# EasyEDA Pro project BMS-Mainboard.epro, board PCB1
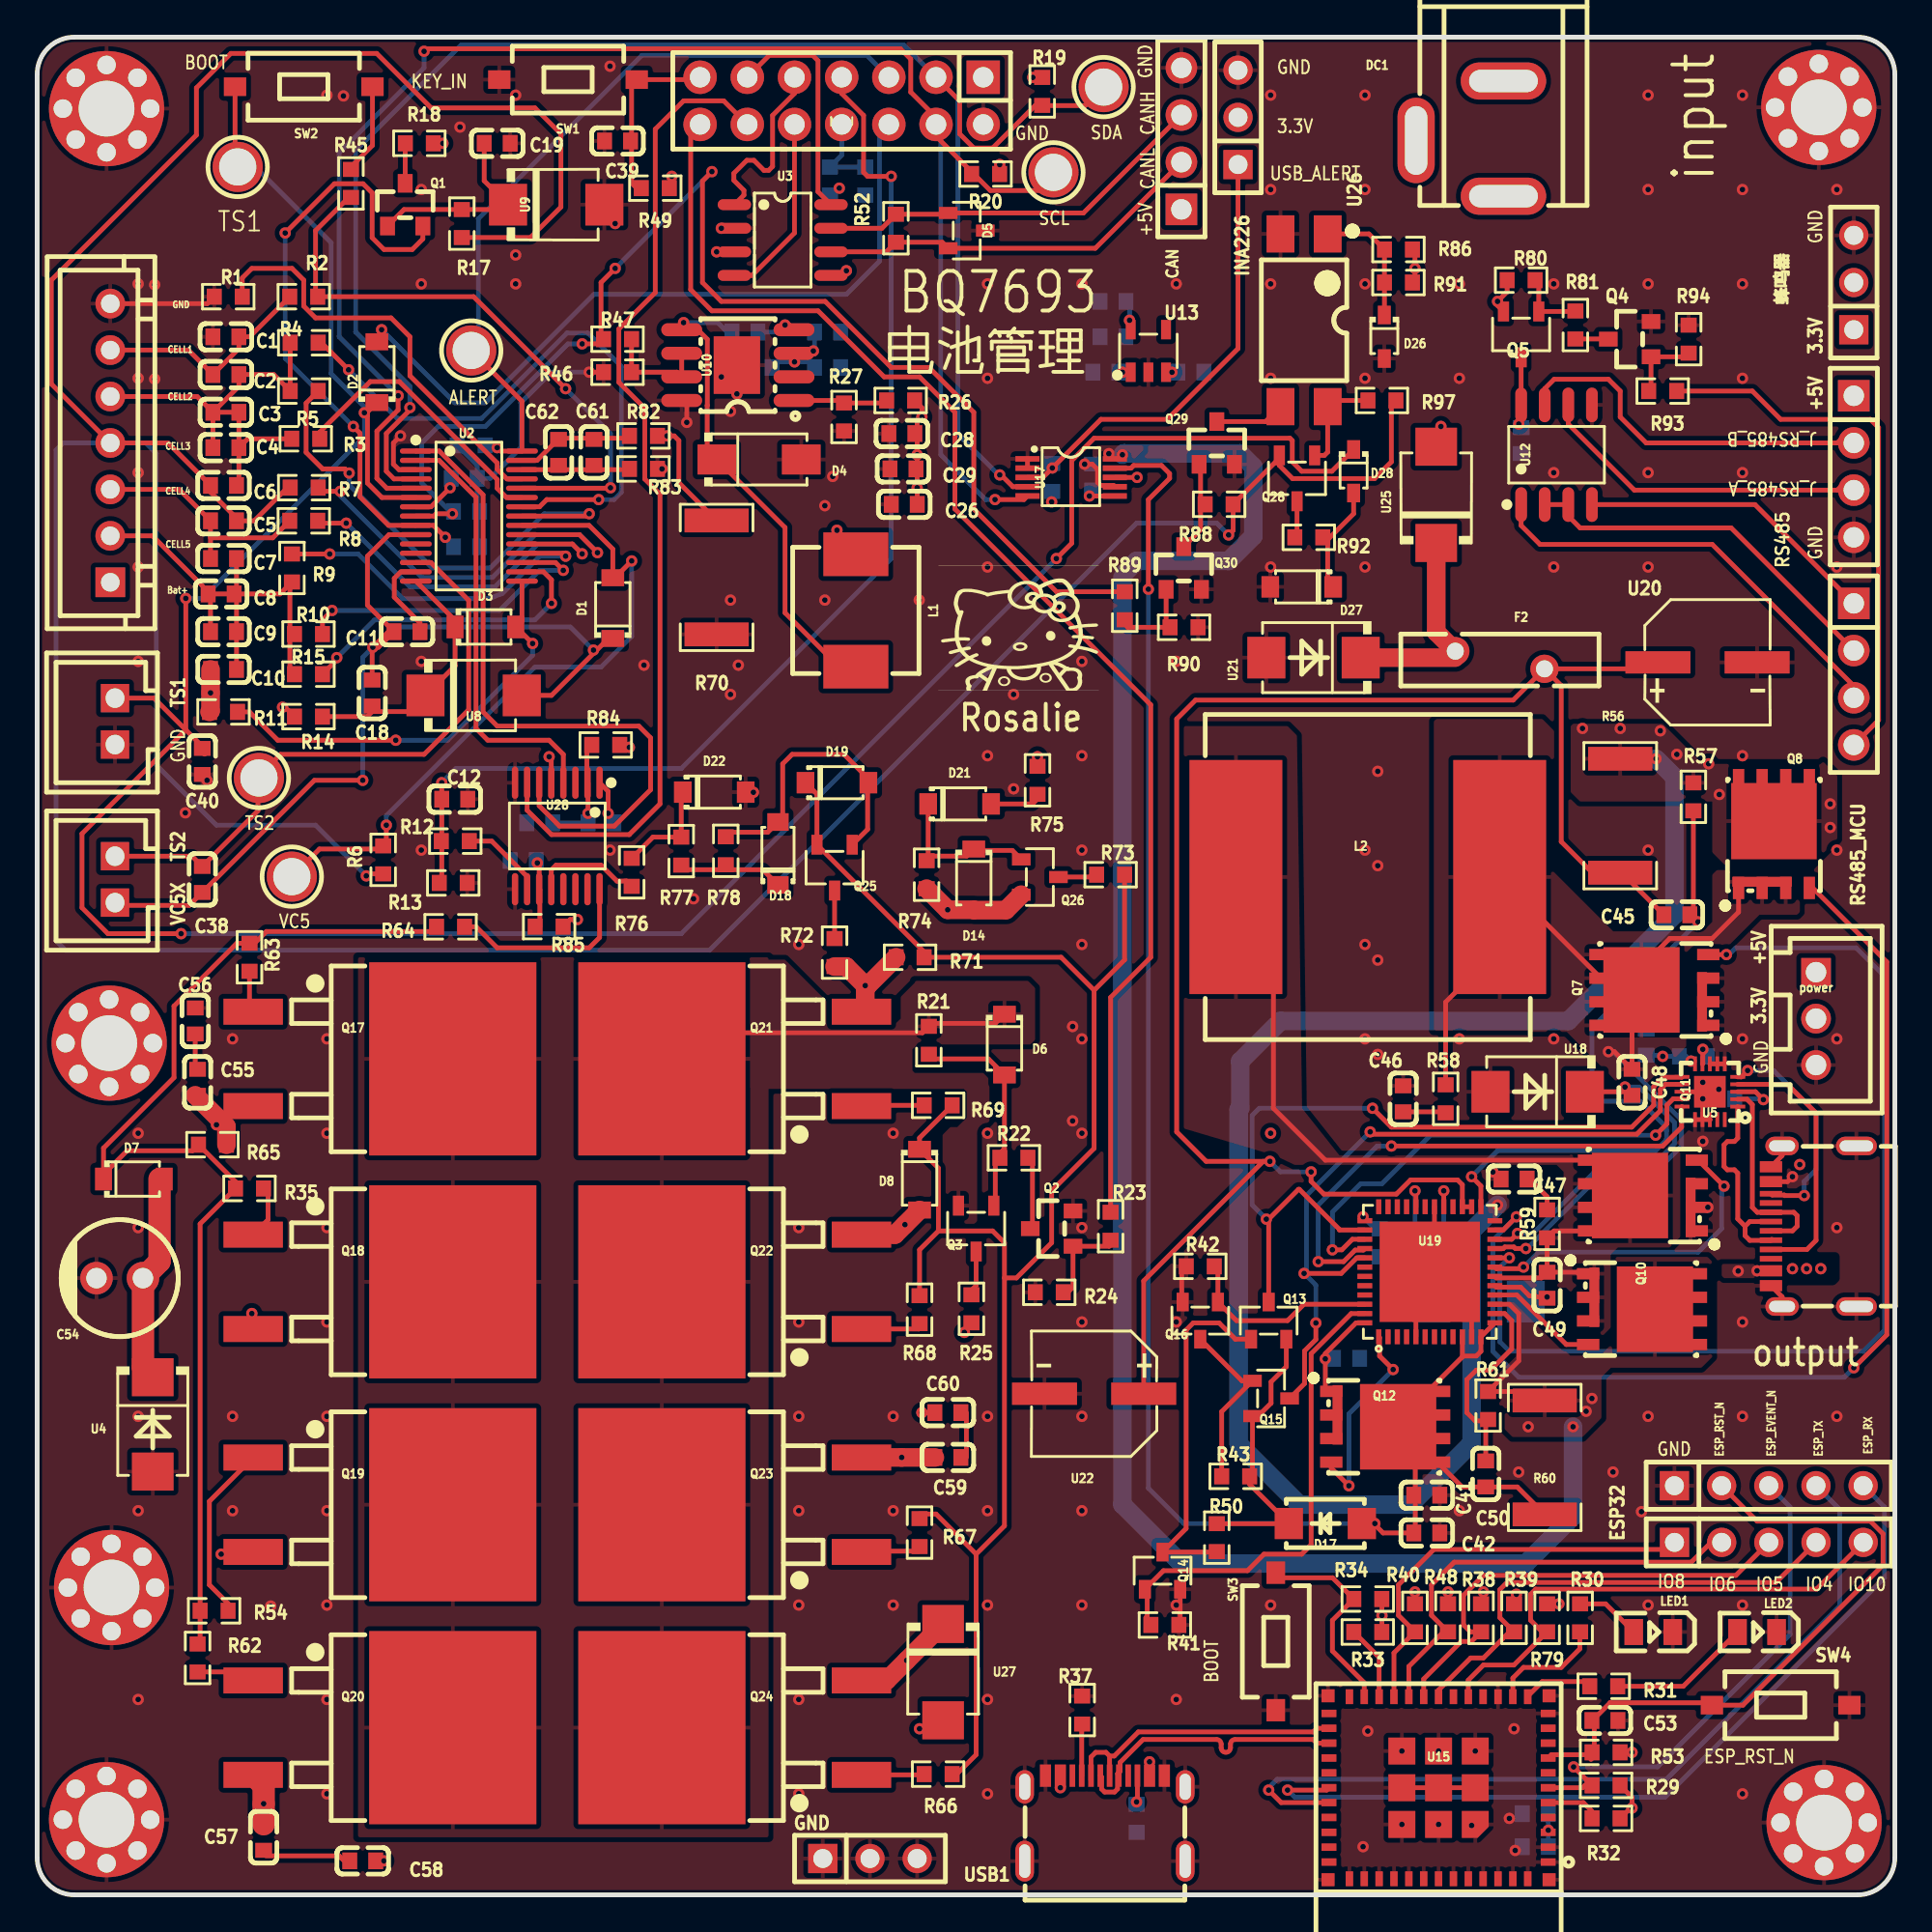
[diagram p7: board, top side]
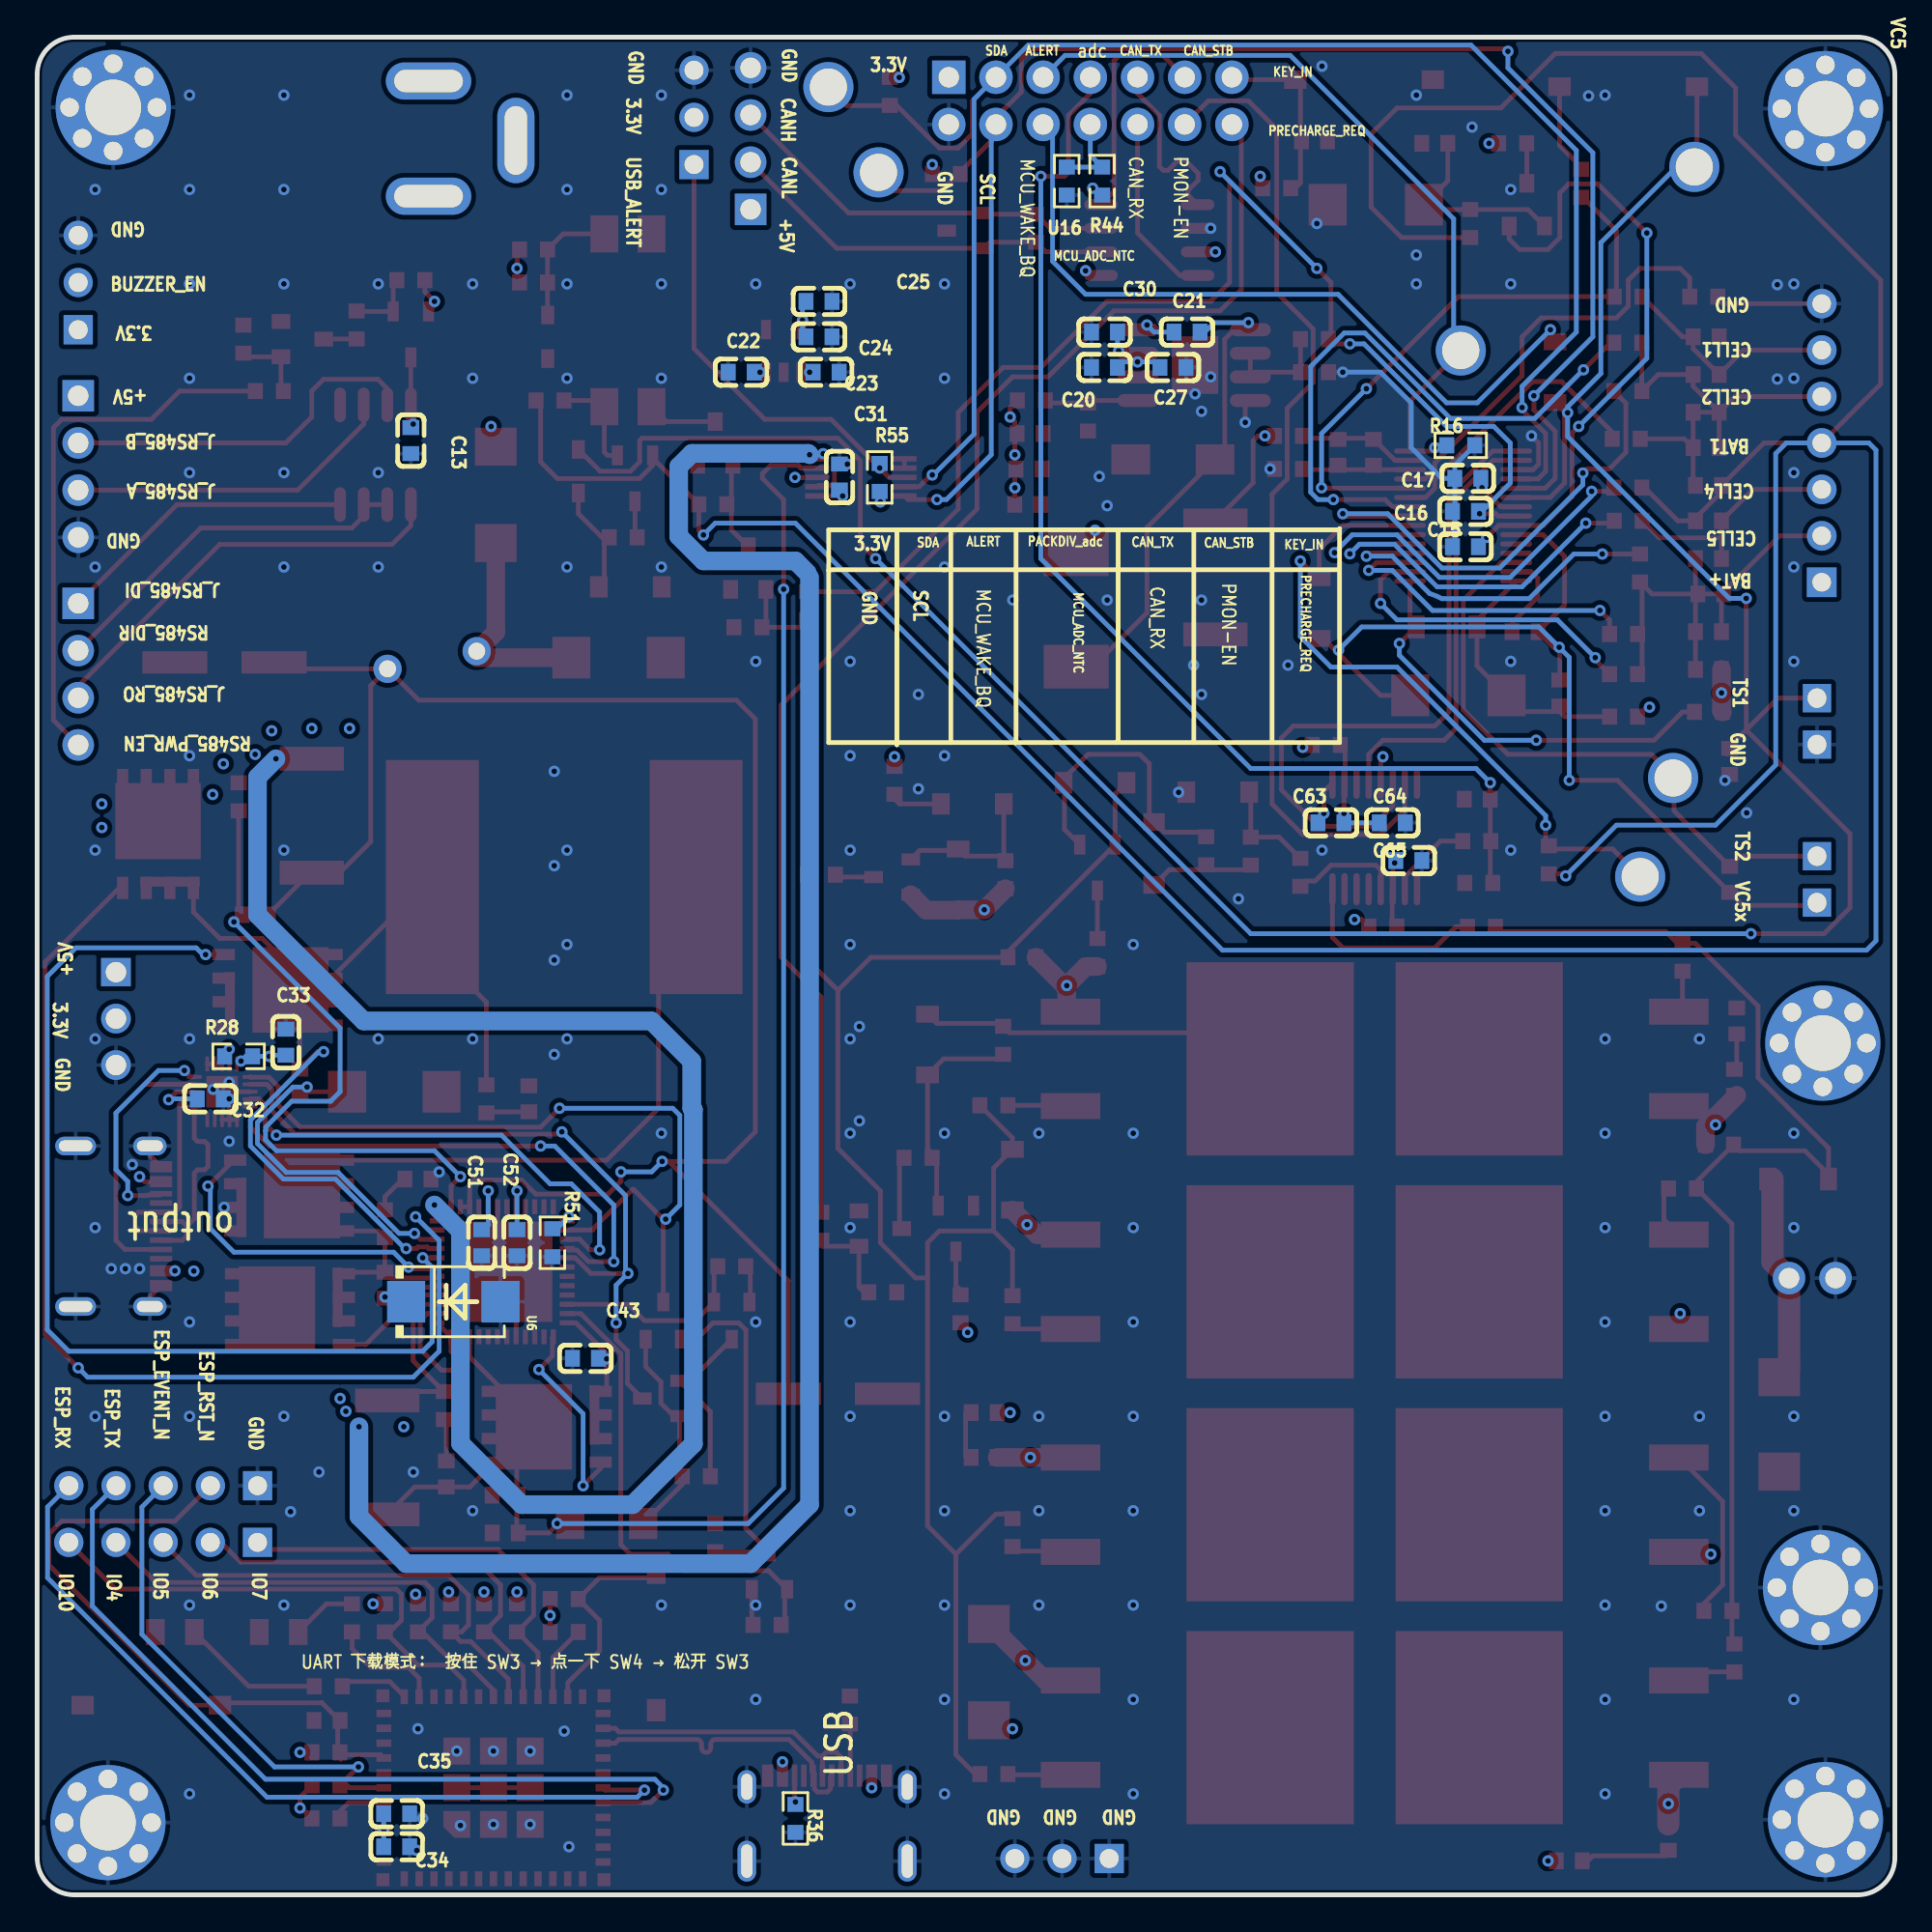
[diagram p8: board, bottom side, seen from below]

Outline 100 x 100 mm; copper layers: Top Layer, Inner1, Inner2, Bottom Layer. Coordinates in mm from the lower left corner of the outline.
Outline path: 0,98 0,2 arc(0.59,0.59) 2,0 98,0 arc(99.41,0.59) 100,2 100,98 arc(99.41,99.41) 98,100 2,100 arc(0.59,99.41) 0,98
Stack: Top Layer 0.035mm Outer layer thickness 1oz / Dielectric1 0.2104mm 7628 RC49% 8.6mil / Inner1 0.0152mm Inner layer thickness / Dielectric2 1.065mm 1.1mm H/HOZ Copper / Inner2 0.0152mm Inner layer thickness / Dielectric3 0.2104mm 7628 RC49% 8.6mil / Bottom Layer 0.035mm Outer layer thickness 1oz

## Design rules (mm)
net USB_D+: ESP_USB
net USB_D-: ESP_USB
spacing copperThickness1oz (default): track to track 0.102, other pairs 0.152 to 0.3
spacing copperThickness2oz: track to track 0.203, other pairs 0.152 to 0.3
track width copperThickness1oz (default): min 0.127, default 0.254, max 2.54
track width copperThickness2oz: min 0.203, default 0.254, max 2.54
differential pair differentialPair (default): width min 0.127, default 0.254, max 2.54; gap min 0.152, default 0.152
net GND uses copperRegion
net MID+ uses copperRegion
net LX1 uses copperRegion
net LX2 uses copperRegion
net PCON uses copperRegion
net PCIN uses copperRegion
net USB_VBUS uses copperRegion

## Placement (name value [footprint] x y rotation side)
C1  1uF  [C0603]  10.16 83.87 0 top
C2  1uF  [C0603]  10.16 81.84 0 top
C3  1uF  [C0603]  10.16 79.81 0 top
C4  1uF  [C0603]  10.16 77.9 0 top
C5  1uF  [C0603]  10.03 73.97 180 top
C6  1uF  [C0603]  10.03 75.87 180 top
C7  1uF  [C0603]  10.03 71.93 0 top
C8  1uF  [C0603]  9.91 70.03 0 top
C9  1uF  [C0603]  10.03 68 0 top
C10  1uF  [C0603]  10.03 65.96 180 top
C11  1uF  [C0603]  19.91 68 180 top
C12  10nF  [C0603]  22.48 58.98 180 top
C13  100nF  [C0603]  79.88 78.28 90 bottom
C15  1uF  [C0603]  23.11 72.57 180 bottom
C16  1uF  [C0603]  23.11 74.47 0 bottom
C17  10uF  [C0603]  22.99 76.25 0 bottom
C18  0.1uF  [C0603]  18.03 64.69 90 top
C19  0.1uF  [C0603]  24.77 94.28 0 top
C20  2.2uF  [C0603]  42.54 82.22 0 bottom
C21  0.1uF  [C0603]  38.1 84.12 0 bottom
C22  100nF  [C0603]  62.1 81.97 180 bottom
C23  22uF  [C0603]  57.53 81.97 0 bottom
C24  100nF  [C0603]  57.91 83.87 0 bottom
C25  22uF  [C0603]  57.91 85.78 0 bottom
C26  4.7uF  [C0603]  46.68 74.85 180 top
C27  2.2uF  [C0603]  38.86 82.22 180 bottom
C28  100nF  [C0603]  46.55 78.66 180 top
C29  100uF  [C0603]  46.61 76.76 180 top
C30  100nF  [C0603]  42.54 84.12 0 bottom
C31  100nF  [C0603]  56.81 76.32 270 bottom
C32  0.1uF  [C0603]  90.68 42.85 0 bottom
C33  1uF  [C0603]  86.61 45.9 270 bottom
C34  100nF  [C0603]  80.65 2.59 0 bottom
C35  10uF  [C0603]  80.65 4.37 0 bottom
C38  4.7nF  [C0603]  8.89 54.66 90 top
C39  100nF  [C0603]  31.24 94.41 0 top
C40  4.7nF  [C0603]  8.89 61.01 90 top
C41  100uF  [C0603]  74.8 21.51 0 top
C42  100nF  [C0603]  74.8 19.48 0 top
C43  10uF  [C0603]  70.49 28.88 180 bottom
C45  1uF  [C0603]  88.26 52.76 180 top
C46  1nF  [C0603]  73.53 42.85 270 top
C47  1nF  [C0603]  79.5 38.53 0 top
C48  100nF  [C0603]  85.85 43.74 270 top
C49  100nF  [C0603]  81.28 32.82 270 top
C50  1uF  [C0603]  77.98 22.66 90 top
C51  2.2uF  [C0603]  76.07 35.1 270 bottom
C52  2.2uF  [C0603]  74.17 35.1 90 bottom
C53  1uF  [C0603]  84.39 9.39 180 top
C54  47uF  [CAP-TH_BD6.3-P2.50-D0.6-FD]  4.44 33.2 180 top
C55  100nF  [C0603]  8.64 43.74 90 top
C56  100nF  [C0603]  8.51 47.04 90 top
C57  100nF  [C0603]  12.19 3.1 270 top
C58  100nF  [C0603]  17.53 1.83 0 top
C59  100nF  [C0603]  49.02 23.55 0 top
C60  100nF  [C0603]  49.02 25.96 180 top
C61  100pF  [C0603]  29.97 77.65 90 top
C62  100nF  [C0603]  28.07 77.65 90 top
C63  470nF  [C0603]  30.35 57.71 180 bottom
C64  10nF  [C0603]  27.05 57.71 0 bottom
C65  10nF  [C0603]  26.16 55.68 0 bottom
CAN  2.54-1*4P母  [HDR-TH_4P-P2.54-V-F]  61.59 94.54 90 top
CN1  ZX-XH2.54-7PZZ-GW  [CONN-TH_7P-P2.50_HCTL_XH-7A]  3.94 78.16 90 top
CN7  ntc1_ts1  [CONN-TH_XH2.54-2P]  4.19 63.17 90 top
CN8  ntc2_ts2  [CONN-TH_XH2.54-2P]  4.19 54.66 90 top
D1  MMSZ5232BT1G  [SOD-123_L2.7-W1.6-LS3.7-RD]  30.99 69.27 90 top
D2  MMSZ5232BT1G  [SOD-123_L2.7-W1.6-LS3.7-RD]  18.29 81.97 90 top
D3  MMSZ5232BT1G  [SOD-123_L2.7-W1.6-LS3.7-RD]  24.13 68.25 0 top
D4  SS110  [PMDS_L4.5-W2.6-LS5.0-RD]  38.86 77.27 0 top
D5  SM24CANA-02HTG-ES  [SOT-23-3_L2.9-W1.3-P1.90-LS2.4-BR]  50.04 89.59 180 top
D6  BZT52C12  [SOD-123_L2.7-W1.6-LS3.7-RD]  52.07 45.77 270 top
D7  BZT52C16_16v  [SOD-123_L2.7-W1.6-LS3.7-RD]  5.21 38.53 0 top
D8  BZT52C16_16v  [SOD-123_L2.7-W1.6-LS3.7-RD]  47.5 38.5 270 top
D14  BZT52C16_15v  [SOD-123_L2.7-W1.6-LS3.7-RD]  50.42 54.66 270 top
D17  SS14  [SMA_L4.2-W2.6-LS5.0-RD_1]  69.34 19.99 0 top
D18  BAT46W-7-F  [SOD-123_L2.8-W1.8-LS3.7-RD]  39.88 56.06 90 top
D19  MMSZ5231B  [SOD-123_L2.8-W1.8-LS3.7-RD]  43.05 59.87 0 top
D21  BAT46W-7-F  [SOD-123_L2.8-W1.8-LS3.7-RD]  49.66 58.72 0 top
D22  BAT46W-7-F  [SOD-123_L2.8-W1.8-LS3.7-RD]  36.45 59.36 0 top
D26  1N4148WS  [SOD-323_L1.8-W1.3-LS2.5-RD]  72.52 83.87 270 top
D27  BZT52C3V0  [SOD-123_L2.8-W1.8-LS3.7-RD]  68.07 70.41 180 top
D28  1N4148WS  [SOD-323_L1.8-W1.3-LS2.5-RD]  70.87 76.63 270 top
DC1  DC005  [DC-IN-TH_DC005]  76.58 94.54 270 top
eda image copy occupy  TP-红色测试点  [TESTPOINT-TH_BD3.2]  54.71 92.72 0 top
ESP32  2.54-1*5P母  [HDR-TH_5P-P2.54-V-F]  93.21 22.02 0 top
F2  PPTC/7.5A/72V  [FUSE-TH_L10.8-W2.7-P4.85-D0.6-S0.1]  78.74 66.47 0 top
GND  PM254V-11-03-H85  [HDR-TH_3P-P2.54-V-F]  44.83 1.96 0 top
H2  2.54-1*5P母  [HDR-TH_5P-P2.54-V-F]  93.22 18.97 0 top
INA226  PM254V-11-03-H85  [HDR-TH_3P-P2.54-V-F]  64.64 95.68 90 top
J1  HDR-M-2.54_1x1  [定位孔]  96.19 3.89 0 top
J2  HDR-M-2.54_1x1  [定位孔]  3.73 4.05 0 top
J3  HDR-M-2.54_1x1  [定位孔]  3.73 96.15 0 top
J4  HDR-M-2.54_1x1  [定位孔]  95.91 96.22 0 top
J5  HDR-M-2.54_1x1  [定位孔]  3.88 45.85 0 top
J6  HDR-M-2.54_1x1  [定位孔]  4 16.54 0 top
L1  33uH  [IND-SMD_L7.7-W6.6_APS07A30M220]  44.07 69.14 90 top
L2  10uH  [IND-SMD_L17.5-W17.5_CKST1707]  71.63 54.79 0 top
LED1  KT-0805G  [LED0805-R-RD]  87 14.15 180 top
LED2  KT-0805G  [LED0805-R-RD]  92.58 14.15 180 top
MCU  2.54-2*7P母  [HDR-TH_14P-P2.54-V-F-R2-C7-S2.54-1]  43.31 96.57 180 top
power  3PIN白色直针插座  [CONN-TH_3P-P2.50_3PIN]  95.76 47.17 270 top
Q1  2N7002,215  [SOT-23_L2.9-W1.3-P1.90-LS2.4-BR]  19.81 90.98 270 top
Q2  2N7002,215  [SOT-23_L2.9-W1.3-P1.90-LS2.4-BR]  54.61 35.86 0 top
Q3  ZXMP10A13FTA  [SOT-23-3_L2.9-W1.6-P1.90-LS2.8-BR]  50.55 35.86 90 top
Q4  2N7002,215  [SOT-23_L2.9-W1.3-P1.90-LS2.4-BR]  85.72 83.74 0 top
Q5  BSS84LT1G  [SOT-23-3_L2.9-W1.6-P1.90-LS2.8-BR]  79.88 84 90 top
Q7  BSC059N04LS6  [TDSON-8_L6.0-W5.0-P1.27-LS6.2-BL]  87.1 48.71 90 top
Q8  BSC059N04LS6  [TDSON-8_L6.0-W5.0-P1.27-LS6.2-BL]  93.49 57.05 0 top
Q10  BSC059N04LS6  [TDSON-8_L6.0-W5.0-P1.27-LS6.2-BL]  86.49 37.64 90 top
Q11  BSC059N04LS6  [TDSON-8_L6.0-W5.0-P1.27-LS6.2-BL]  86.34 31.53 270 top
Q12  BSC059N04LS6  [TDSON-8_L6.0-W5.0-P1.27-LS6.2-BL]  72.52 25.2 270 top
Q13  AO3401A  [SOT-23-3_L2.9-W1.3-P1.90-LS2.4-BR]  66.29 30.91 270 top
Q14  2N7002  [SOT-23-3_L2.9-W1.3-P1.90-LS2.4-BR]  60.58 17.45 270 top
Q15  AO3401A  [SOT-23-3_L2.9-W1.3-P1.90-LS2.4-BR]  66.42 26.72 180 top
Q16  2N7002  [SOT-23-3_L2.9-W1.3-P1.90-LS2.4-BR]  62.61 30.91 90 top
Q17  IRFS4310ZTRLPBF-HXY  [TO-263-2_L10.0-W8.8-P5.08-LS15.4-BR]  17 45 180 top
Q18  IRFS4310ZTRLPBF-HXY  [TO-263-2_L10.0-W8.8-P5.08-LS15.4-BR]  17 33 180 top
Q19  IRFS4310ZTRLPBF-HXY  [TO-263-2_L10.0-W8.8-P5.08-LS15.4-BR]  17 21 180 top
Q20  IRFS4310ZTRLPBF-HXY  [TO-263-2_L10.0-W8.8-P5.08-LS15.4-BR]  17 9 180 top
Q21  IRFS4310ZTRLPBF-HXY  [TO-263-2_L10.0-W8.8-P5.08-LS15.4-BR]  39 45 0 top
Q22  IRFS4310ZTRLPBF-HXY  [TO-263-2_L10.0-W8.8-P5.08-LS15.4-BR]  39 33 0 top
Q23  IRFS4310ZTRLPBF-HXY  [TO-263-2_L10.0-W8.8-P5.08-LS15.4-BR]  39 21 0 top
Q24  IRFS4310ZTRLPBF-HXY  [TO-263-2_L10.0-W8.8-P5.08-LS15.4-BR]  39 9 0 top
Q25  BSS84LT1G  [SOT-23-3_L2.9-W1.6-P1.90-LS2.8-BR]  42.93 55.3 90 top
Q26  BSS123N  [SOT-23-3_L2.9-W1.3-P1.90-LS2.4-BR]  53.97 54.79 180 top
Q28  ZXMP10A13FTA  [SOT-23-3_L2.9-W1.6-P1.90-LS2.8-BR]  67.82 76.25 90 top
Q29  2N7002,215  [SOT-23_L2.9-W1.3-P1.90-LS2.4-BR]  63.5 78.16 270 top
Q30  2N7002,215  [SOT-23_L2.9-W1.3-P1.90-LS2.4-BR]  61.72 71.42 270 top
R1  1kΩ  [R0603]  10.29 86.03 0 top
R2  1kΩ  [R0603]  14.35 86.03 0 top
R3  1kΩ  [R0603]  14.46 78.38 0 top
R4  1kΩ  [R0603]  14.38 83.55 0 top
R5  1kΩ  [R0603]  14.38 80.95 0 top
R6  1kΩ  [R0603]  18.63 55.71 90 top
R7  1kΩ  [R0603]  14.38 75.75 0 top
R8  1kΩ  [R0603]  14.35 73.97 0 top
R9  1kΩ  [R0603]  13.72 71.42 90 top
R10  1kΩ  [R0603]  14.61 67.87 0 top
R11  1kΩ  [R0603]  10.03 63.68 0 top
R12  220kΩ  [R0603]  22.51 56.72 180 top
R13  10kΩ  [R0603]  22.4 54.47 0 top
R14  100Ω  [R0603]  14.61 63.42 0 top
R15  1kΩ  [R0603]  14.61 65.71 0 top
R16  470kΩ  [R0603]  23.37 78.03 180 bottom
R17  100Ω  [R0603]  22.86 89.97 90 top
R18  10Ω  [R0603]  20.57 94.28 0 top
R19  4.7kΩ  [R0603]  54.1 97.08 90 top
R20  4.7kΩ  [R0603]  51.05 92.63 0 top
R21  100kΩ  [R0603]  48 46 270 top
R22  4.7kΩ  [R0603]  52.58 39.67 0 top
R23  4.7kΩ  [R0603]  57.78 35.99 270 top
R24  100kΩ  [R0603]  54.48 32.44 180 top
R25  100Ω  [R0603]  50.29 31.55 270 top
R26  240kΩ  [R0603]  46.48 80.44 0 top
R27  10kΩ  [R0603]  43.43 79.55 90 top
R28  100kΩ  [R0603]  89.15 45.14 0 bottom
R29  47kΩ  [R0603]  84.46 5.89 0 top
R30  1kΩ  [R0603]  83.06 14.91 270 top
R31  1kΩ  [R0603]  84.33 11.23 180 top
R32  10kΩ  [R0603]  84.46 4.12 0 top
R33  10kΩ  [R0603]  71.63 14.15 0 top
R34  10kΩ  [R0603]  71.63 15.93 0 top
R35  47Ω  [R0603]  11.43 38.02 180 top
R36  5.1kΩ  [R0603]  59.18 4.12 90 bottom
R37  5.1kΩ  [R0603]  56.25 9.95 90 top
R38  10kΩ  [R0603]  77.72 14.91 90 top
R39  10kΩ  [R0603]  79.5 14.91 90 top
R40  10kΩ  [R0603]  74.17 14.91 90 top
R41  10kΩ  [R0603]  60.71 14.53 180 top
R42  10kΩ  [R0603]  62.61 33.83 0 top
R43  10kΩ  [R0603]  64.52 22.53 0 top
R44  100kΩ  [R0603]  42.67 92.25 270 bottom
R45  3kΩ  [R0603]  16.89 92.13 270 top
R46  47kΩ  [R0603]  31.24 81.97 0 top
R47  4.7kΩ  [R0603]  31.24 83.74 180 top
R48  10kΩ  [R0603]  75.95 14.91 90 top
R49  10kΩ  [R0603]  33.27 91.87 0 top
R50  10kΩ  [R0603]  63.5 19.23 90 top
R51  100kΩ/R_PDO  [R0603]  72.26 35.1 90 bottom
R52  DNP~120R  [R0603]  46.23 89.71 90 top
R53  10kΩ  [R0603]  84.46 7.67 0 top
R54  47Ω  [R0603]  9.53 15.29 180 top
R55  10kΩ  [R0603]  54.64 76.3 270 bottom
R56  5mΩ  [R2512]  85.22 58.09 270 top
R57  10Ω  [R0603]  89.15 59.11 90 top
R58  2Ω  [R0603]  75.82 42.85 90 top
R59  2Ω  [R0603]  81.28 36.12 270 top
R60  5mΩ  [R2512]  81.15 23.55 90 top
R61  10Ω  [R0603]  78.1 26.34 90 top
R62  47Ω  [R0603]  8.64 12.75 90 top
R63  47Ω  [R0603]  11.43 50.47 90 top
R64  100Ω  [R0603]  22.25 52.11 0 top
R65  10MΩ  [R0603]  9.44 40.38 0 top
R66  47Ω  [R0603]  48.5 6.5 180 top
R67  47Ω  [R0603]  47.5 19.5 270 top
R68  47Ω  [R0603]  47.5 31.5 270 top
R69  47Ω  [R0603]  48.5 42.5 180 top
R70  4mΩ  [R2512]  36.58 70.92 90 top
R71  10MΩ  [R0603]  46.99 50.47 0 top
R72  47Ω  [R0603]  42.93 50.72 90 top
R73  470Ω  [R0603]  57.78 54.92 180 top
R74  10MΩ  [R0603]  47.88 54.92 90 top
R75  10kΩ  [R0603]  53.85 60 270 top
R76  100Ω  [R0603]  32 55.04 270 top
R77  10kΩ  [R0603]  34.67 56.19 90 top
R78  68kΩ  [R0603]  37.07 56.2 270 top
R79  10kΩ  [R0603]  81.28 14.91 90 top
R80  100kΩ  [R0603]  79.88 86.92 0 top
R81  10kΩ  [R0603]  82.8 84.51 270 top
R82  100Ω  [R0603]  32.64 78.54 0 top
R83  100Ω  [R0603]  32.64 76.76 0 top
R84  100Ω  [R0603]  30.61 61.9 0 top
R85  100Ω  [R0603]  27.56 52.12 0 top
R86  10kΩ  [R0603]  73.28 88.57 180 top
R88  100kΩ  [R0603]  63.63 74.85 0 top
R89  1kΩ  [R0603]  58.55 69.39 270 top
R90  100kΩ  [R0603]  61.74 68.23 180 top
R91  10kΩ  [R0603]  73.28 86.79 180 top
R92  3kΩ  [R0603]  68.45 73.08 180 top
R93  1kΩ  [R0603]  87.5 80.95 180 top
R94  100kΩ  [R0603]  88.9 83.74 90 top
R97  47kΩ  [R0603]  72.39 80.44 180 top
RS485  2.54-1*4P母  [HDR-TH_4P-P2.54-V-F]  97.79 76.89 270 top
RS485_MCU  2.54-1*4P母  [HDR-TH_4P-P2.54-V-F]  97.79 65.71 270 top
SW1  TS-1101-C-W  [SW-SMD_L6.0-W3.3-LS8.0_TS-1101-C-W]  28.57 97.71 0 top
SW2  TS-1101-C-W  [SW-SMD_L6.0-W3.3-LS8.0_TS-1101-C-W]  14.35 97.33 0 top
SW3  TS-1101-C-W  [SW-SMD_L6.0-W3.3-LS8.0_TS-1101-C-W]  66.68 13.64 90 top
SW4  TS-1101-C-W  [SW-SMD_L6.0-W3.3-LS8.0_TS-1101-C-W]  93.85 10.21 180 top
U1  TP-红色测试点  [TESTPOINT-TH_BD3.2]  57.41 97.31 0 top
U2  BQ7693003DBT  [TSSOP-30_L7.8-W4.4-P0.50-LS6.4-BL]  23.24 74.22 270 top
U3  TCAN1042VDQ1  [SOIC-8_L4.9-W3.9-P1.27-LS6.0-BL]  40.13 89.08 270 top
U4  SMBJ33A  [SMB_L4.4-W3.6-LS5.4-RD]  6.22 25.32 270 top
U5  TPD6S300ARUKR  [WQFN-20_L3.0-W3.0-P0.40-TL-EP1.7]  90.04 43.23 180 top
U6  SMBJ30A  [SMB_L4.4-W3.6-LS5.4-RD]  77.6 31.93 180 bottom
U8  SS56  [SMB_L4.3-W3.6-LS5.4-RD]  23.5 64.57 0 top
U9  SS56  [SMB_L4.3-W3.6-LS5.4-RD]  27.94 90.98 0 top
U10  MP9486AGN-Z  [SOIC-8_L4.9-W3.9-P1.27-LS6.0-BL-EP3.1]  37.72 82.35 90 top
U11  TP-红色测试点  [TESTPOINT-TH_BD3.2]  23.37 83.13 0 top
U12  MAX485ESA  [SOP-8_L4.9-W3.9-P1.27-LS6.0-BL]  81.79 77.52 0 top
U13  RT9080-33GJ5  [TSOT-23-5_L2.9-W1.6-P0.95-LS2.8-BL]  59.82 83.11 0 top
U14  TP-红色测试点  [TESTPOINT-TH_BD3.2]  10.8 93.02 0 top
U15  2.4GHz  [WIFIM-SMD_ESP32-C3-MINI-1]  75.44 5.77 180 top
U16  NTC0805-104J4250HAT-ZQH  [R0603]  44.58 92.25 270 bottom
U17  INA226AQDGSRQ1  [VSSOP-10_L3.0-W3.0-P0.50-LS4.9-BL]  55.66 76.3 270 top
U18  SMBJ30A  [SMB_L4.4-W3.6-LS5.4-RD]  80.77 43.23 180 top
U19  IP6559-C  [QFN-48_L7.0-W7.0-P0.50-BL-EP5.4]  74.97 33.54 0 top
U20  100uF贴片电解  [CAP-SMD_BD6.3-L6.6-W6.6-LS7.4-FD]  89.92 66.34 0 top
U21  SMBJ33A  [SMB_L4.4-W3.6-LS5.4-RD]  68.71 66.6 180 top
U22  0.1uF贴片电解  [CAP-SMD_BD6.3-L6.6-W6.6-LS7.4-FD]  56.9 26.97 180 top
U23  TP-红色测试点  [TESTPOINT-TH_BD3.2]  11.94 60.12 0 top
U24  TP-红色测试点  [TESTPOINT-TH_BD3.2]  13.71 54.81 0 top
U25  SS56  [SMB_L4.3-W3.6-LS5.4-RD]  75.31 75.36 90 top
U26  PC817X2NIP0F  [SMD-4_L4.6-W6.5-P2.54-LS10.2-TL]  68.2 84.76 270 top
U27  MURS360  [SMB_L4.3-W3.6-LS5.4-RD]  48.77 11.99 270 top
U28  BQ76200PWR  [TSSOP-16_L5.0-W4.4-P0.65-LS6.4-BL]  28 57 180 top
USB1  USB4215-03-A  [USB-C-SMD_GT-USB-7010B]  57.48 4.12 0 top
USB4  USB4215-03-A  [USB-C-SMD_GT-USB-7010B]  95.63 35.99 90 top
蜂鸣器  PM254V-11-03-H85  [HDR-TH_3P-P2.54-V-F]  97.79 86.79 90 top

## Footprints (pads in the part's own frame, mm; a bottom-side part is the same pattern mirrored in y, then rotated)
C0603
  rect 0.8x0.9 smd: 1(-0.7,0) 2(0.7,0)
CAP-SMD_BD6.3-L6.6-W6.6-LS7.4-FD
  rect 3.5x1.2 smd: 1(-2.67,0) 2(2.67,0)
CAP-TH_BD6.3-P2.50-D0.6-FD
  round 1.75 hole 1.1: 1(-1.25,0) 2(1.25,0)
CONN-TH_3P-P2.50_3PIN
  rect 1.524x1.6 hole 1.1: 1(-2.5,0)
  round 1.6 hole 1.1: 2(0,0) 3(2.5,0)
CONN-TH_7P-P2.50_HCTL_XH-7A
  rect 1.6x1.6 hole 1: 1(-7.5,0)
  round 1.6 hole 1: 2(-5,0) 3(-2.5,0) 4(0,0) 5(2.5,0) 6(5,0) 7(7.5,0)
CONN-TH_XH2.54-2P
  rect 1.524x1.524 hole 1.05x1: 1(-1.25,0) 2(1.25,0)
DC-IN-TH_DC005
  oval 2x4.6 hole 1.2x3.7: 1(3.1,2.35) 2(-3.1,2.35)
  oval 4.6x2 hole 3.7x1.2: 3(0.1,-2.35)
FUSE-TH_L10.8-W2.7-P4.85-D0.6-S0.1
  round 1.524 hole 0.914: 1(-2.4,0.475) 2(2.4,-0.475)
HDR-TH_3P-P2.54-V-F
  rect 1.575x1.575 hole 1.02: 1(-2.54,0)
  round 1.575 hole 1.02: 2(0,0) 3(2.54,0)
HDR-TH_4P-P2.54-V-F
  rect 1.7x1.7 hole 1.1: 1(-3.81,0)
  round 1.7 hole 1.1: 2(-1.27,0) 3(1.27,0) 4(3.81,0)
HDR-TH_5P-P2.54-V-F
  rect 1.575x1.575 hole 1.02: 1(-5.08,0)
  round 1.575 hole 1.02: 2(-2.54,0) 3(0,0) 4(2.54,0) 5(5.08,0)
HDR-TH_14P-P2.54-V-F-R2-C7-S2.54-1
  rect 1.8x1.8 hole 1.1: 1(-7.62,-1.27)
  round 1.8 hole 1.1: 2(-7.62,1.27) 3(-5.08,-1.27) 4(-5.08,1.27) 5(-2.54,-1.27) 6(-2.54,1.27) 7(0,-1.27) 8(0,1.27) 9(2.54,-1.27) 10(2.54,1.27) 11(5.08,-1.27) 12(5.08,1.27) 13(7.62,-1.27) 14(7.62,1.27)
IND-SMD_L7.7-W6.6_APS07A30M220
  rect 2.35x3.5 smd: 1(-3.025,0) 2(3.025,0)
IND-SMD_L17.5-W17.5_CKST1707
  rect 5x12.6 smd: 1(-7.1,0) 2(7.1,0)
LED0805-R-RD
  rect 1x1.399 smd: 1(1.05,0) 2(-1.05,0)
PMDS_L4.5-W2.6-LS5.0-RD
  rect 2.085x1.62 smd: 1(-2.271,0) 2(2.271,0)
QFN-48_L7.0-W7.0-P0.50-BL-EP5.4
  rect 0.28x0.8 smd: 1(-2.75,-3.5) 2(-2.25,-3.5) 3(-1.75,-3.5) 4(-1.25,-3.5) 5(-0.75,-3.5) 6(-0.25,-3.5) 7(0.25,-3.5) 8(0.75,-3.5) 9(1.25,-3.5) 10(1.75,-3.5) 11(2.25,-3.5) 12(2.75,-3.5) 25(2.75,3.5) 26(2.25,3.5) 27(1.75,3.5) 28(1.25,3.5) 29(0.75,3.5) 30(0.25,3.5) 31(-0.25,3.5) 32(-0.75,3.5) 33(-1.25,3.5) 34(-1.75,3.5) 35(-2.25,3.5) 36(-2.75,3.5)
  rect 0.8x0.28 smd: 13(3.5,-2.75) 14(3.5,-2.25) 15(3.5,-1.75) 16(3.5,-1.25) 17(3.5,-0.75) 18(3.5,-0.25) 19(3.5,0.25) 20(3.5,0.75) 21(3.5,1.25) 22(3.5,1.75) 23(3.5,2.25) 24(3.5,2.75) 37(-3.5,2.75) 38(-3.5,2.25) 39(-3.5,1.75) 40(-3.5,1.25) 41(-3.5,0.75) 42(-3.5,0.25) 43(-3.5,-0.25) 44(-3.5,-0.75) 45(-3.5,-1.25) 46(-3.5,-1.75) 47(-3.5,-2.25) 48(-3.5,-2.75)
  rect 5.4x5.4 smd: 49(0,0)
R0603
  rect 0.806x0.864 smd: 1(-0.753,0) 2(0.753,0)
R2512
  rect 1.282x3.456 smd: 1(-3.067,0) 2(3.067,0)
SMA_L4.2-W2.6-LS5.0-RD_1
  rect 1.52x1.68 smd: 1(-1.965,0) 2(1.965,0)
SMB_L4.3-W3.6-LS5.4-RD
  rect 2.047x2.241 smd: 1(-2.591,0) 2(2.591,0)
SMB_L4.4-W3.6-LS5.4-RD
  rect 2.047x2.241 smd: 1(-2.54,0) 2(2.54,0)
SMD-4_L4.6-W6.5-P2.54-LS10.2-TL
  rect 2x1.5 smd: 1(-4.65,1.27) 2(-4.65,-1.27) 3(4.65,-1.27) 4(4.65,1.27)
SOD-123_L2.7-W1.6-LS3.7-RD
  rect 0.91x1.22 smd: 1(-1.635,0) 2(1.635,0)
SOD-123_L2.8-W1.8-LS3.7-RD
  rect 0.95x1.15 smd: 1(-1.692,0) 2(1.692,0)
SOD-323_L1.8-W1.3-LS2.5-RD
  rect 1x0.7 smd: 1(-1.173,0) 2(1.173,0)
SOIC-8_L4.9-W3.9-P1.27-LS6.0-BL
  oval 0.588x1.8 smd: 1(-1.905,-2.6) 2(-0.635,-2.6) 3(0.635,-2.6) 4(1.905,-2.6) 5(1.905,2.6) 6(0.635,2.6) 7(-0.635,2.6) 8(-1.905,2.6)
SOIC-8_L4.9-W3.9-P1.27-LS6.0-BL-EP3.1
  oval 0.7x2.2 smd: 1(-1.905,-3.022) 2(-0.635,-3.022) 3(0.635,-3.022) 4(1.905,-3.022) 5(1.905,3.022) 6(0.635,3.022) 7(-0.635,3.022) 8(-1.905,3.022)
  rect 3.1x2.5 smd: 9(0,0.051)
SOP-8_L4.9-W3.9-P1.27-LS6.0-BL
  oval 0.63x1.865 smd: 1(-1.905,-2.683) 2(-0.635,-2.683) 3(0.635,-2.683) 4(1.905,-2.683) 5(1.905,2.683) 6(0.635,2.683) 7(-0.635,2.683) 8(-1.905,2.683)
SOT-23-3_L2.9-W1.3-P1.90-LS2.4-BR
  rect 1x0.65 smd: 1(1,-0.95) 2(1,0.95) 3(-1,0)
SOT-23-3_L2.9-W1.6-P1.90-LS2.8-BR
  rect 1.07x0.6 smd: 1(1.235,-0.95) 2(1.235,0.95) 3(-1.235,0)
SOT-23_L2.9-W1.3-P1.90-LS2.4-BR
  rect 1x0.8 smd: 1(1.15,-0.95) 2(1.15,0.95) 3(-1.15,0)
SW-SMD_L6.0-W3.3-LS8.0_TS-1101-C-W
  rect 1.2x1 smd: 1(-3.7,0) 2(3.7,0)
TDSON-8_L6.0-W5.0-P1.27-LS6.2-BL
  rect 0.61x1.2 smd: 1(-1.905,-2.852) 2(-0.635,-2.852) 3(0.635,-2.852) 4(1.905,-2.852)
  rect 3.2x0.53 smd: 3(-0.64,-2.519)
  rect 0.61x1.397 smd: 5(1.905,2.852) 6(0.635,2.852) 7(-0.635,2.852) 8(-1.905,2.852)
  rect 4.6x4.1 smd: 9(0,0.744)
TESTPOINT-TH_BD3.2
  round 2.7 hole 2: 1(0,0)
TO-263-2_L10.0-W8.8-P5.08-LS15.4-BR
  rect 3.2x1.4 smd: 1(5.373,-2.54) 3(5.373,2.54)
  rect 9x10.4 smd: 2(-5.373,0)
TSOT-23-5_L2.9-W1.6-P0.95-LS2.8-BL
  rect 0.532x1.045 smd: 1(-0.95,-1.147) 2(0,-1.147) 3(0.95,-1.147) 4(0.95,1.147) 5(-0.95,1.147)
TSSOP-16_L5.0-W4.4-P0.65-LS6.4-BL
  oval 0.343x1.732 smd: 1(-2.275,-2.866) 2(-1.625,-2.866) 3(-0.975,-2.866) 4(-0.325,-2.866) 5(0.325,-2.866) 6(0.975,-2.866) 7(1.625,-2.866) 8(2.275,-2.866) 9(2.275,2.866) 10(1.625,2.866) 11(0.975,2.866) 12(0.325,2.866) 13(-0.325,2.866) 14(-0.975,2.866) 15(-1.625,2.866) 16(-2.275,2.866)
TSSOP-30_L7.8-W4.4-P0.50-LS6.4-BL
  oval 0.28x1.715 smd: 1(-3.5,-2.857) 2(-3,-2.857) 3(-2.5,-2.857) 4(-2,-2.857) 5(-1.5,-2.857) 6(-1,-2.857) 7(-0.5,-2.857) 8(0,-2.857) 9(0.5,-2.857) 10(1,-2.857) 11(1.5,-2.857) 12(2,-2.857) 13(2.5,-2.857) 14(3,-2.857) 15(3.5,-2.857) 16(3.5,2.857) 17(3,2.857) 18(2.5,2.857) 19(2,2.857) 20(1.5,2.857) 21(1,2.857) 22(0.5,2.857) 23(0,2.857) 24(-0.5,2.857) 25(-1,2.857) 26(-1.5,2.857) 27(-2,2.857) 28(-2.5,2.857) 29(-3,2.857) 30(-3.5,2.857)
USB-C-SMD_GT-USB-7010B
  oval 1x1.8 hole 0.6x1.4: 13(-4.32,1.7) 14(4.32,1.7)
  oval 1x2.2 hole 0.6x1.8: 15(-4.32,-2.3) 16(4.32,-2.3)
  rect 0.6x1.2 smd: A1B12(-3.2,2.3) A4B9(-2.4,2.3) B1A12(3.2,2.3) B4A9(2.4,2.3)
  rect 0.3x1.2 smd: A5(-1.25,2.3) A6(-0.25,2.3) A7(0.25,2.3) A8(1.25,2.3) B5(1.75,2.3) B6(0.75,2.3) B7(-0.75,2.3) B8(-1.75,2.3)
VSSOP-10_L3.0-W3.0-P0.50-LS4.9-BL
  rect 0.3x1.3 smd: 1(-1,-2.35) 2(-0.5,-2.35) 3(0,-2.35) 4(0.5,-2.35) 5(1,-2.35) 6(1,2.35) 7(0.5,2.35) 8(0,2.35) 9(-0.5,2.35) 10(-1,2.35)
WIFIM-SMD_ESP32-C3-MINI-1
  rect 0.8x0.4 smd: 1(-5.9,4) 2(-5.9,3.2) 3(-5.9,2.4) 4(-5.9,1.6) 5(-5.9,0.8) 6(-5.9,0) 7(-5.9,-0.8) 8(-5.9,-1.6) 9(-5.9,-2.4) 10(-5.9,-3.2) 11(-5.9,-4) 25(5.9,-4) 26(5.9,-3.2) 27(5.9,-2.4) 28(5.9,-1.6) 29(5.9,-0.8) 30(5.9,0) 31(5.9,0.8) 32(5.9,1.6) 33(5.9,2.4) 34(5.9,3.2) 35(5.9,4)
  rect 0.4x0.8 smd: 12(-4.8,-4.9) 13(-4,-4.9) 14(-3.2,-4.9) 15(-2.4,-4.9) 16(-1.6,-4.9) 17(-0.8,-4.9) 18(0,-4.9) 19(0.8,-4.9) 20(1.6,-4.9) 21(2.4,-4.9) 22(3.2,-4.9) 23(4,-4.9) 24(4.8,-4.9) 36(4.8,4.9) 37(4,4.9) 38(3.2,4.9) 39(2.4,4.9) 40(1.6,4.9) 41(0.8,4.9) 42(0,4.9) 43(-0.8,4.9) 44(-1.6,4.9) 45(-2.4,4.9) 46(-3.2,4.9) 47(-4,4.9) 48(-4.8,4.9)
  custom 1.45x1.45 smd: 49(-1.975,1.975)
  rect 1.45x1.45 smd: 49(-1.975,0) 49(-1.975,-1.975) 49(0,1.975) 49(0,0) 49(0,-1.975) 49(1.975,1.975) 49(1.975,0) 49(1.975,-1.975)
  rect 0.7x0.7 smd: 50(5.95,4.95) 51(5.95,-4.95) 52(-5.95,-4.95) 53(-5.95,4.95)
WQFN-20_L3.0-W3.0-P0.40-TL-EP1.7
  rect 0.8x0.2 smd: 1(-1.5,0.8) 2(-1.5,0.4) 3(-1.5,0) 4(-1.5,-0.4) 5(-1.5,-0.8) 11(1.5,-0.8) 12(1.5,-0.4) 13(1.5,0) 14(1.5,0.4) 15(1.5,0.8)
  rect 0.2x0.8 smd: 6(-0.8,-1.5) 7(-0.4,-1.5) 8(0,-1.5) 9(0.4,-1.5) 10(0.799,-1.5) 16(0.8,1.5) 17(0.4,1.5) 18(0,1.5) 19(-0.4,1.5) 20(-0.8,1.5)
  rect 1.7x1.7 smd: 21(0,0)
定位孔
  round 6.2 hole 3: 1(0,0)
  round 1 hole 1: 2(-1.662,-1.662) 3(-2.35,0) 4(-1.662,1.662) 5(1.662,-1.662) 6(2.35,0) 7(0,2.35) 8(1.662,1.662) 9(0,-2.35)

## Nets
As in the schematic, except:
GND: C1.1 C12.1 C13.1 C15.1 C16.2 C17.2 C19.2 C20.2 C22.1 C23.1 C24.1 C25.1 C26.2 C27.2 C28.2 C29.2 C30.2 C31.1 C32.1 C33.1 C34.1 C35.1 C39.1 C40.1 C41.2 C42.2 C43.1 C46.1 C47.1 C51.2 C52.1 C53.1 C54.2 C56.2 C64.1 C65.1 CAN.4 CN1.7 CN7.1 D4.2 D5.3 D22.2 D26.2 D27.2 ESP32.1 GND.1 GND.2 GND.3 INA226.3 J1.1 J1.2 J1.3 J1.4 J1.5 J1.6 J1.7 J1.8 J1.9 J2.1 J2.2 J2.3 J2.4 J2.5 J2.6 J2.7 J2.8 J2.9 J3.1 J3.2 J3.3 J3.4 J3.5 J3.6 J3.7 J3.8 J3.9 J4.1 J4.2 J4.3 J4.4 J4.5 J4.6 J4.7 J4.8 J4.9 J6.1 J6.2 J6.3 J6.4 J6.5 J6.6 J6.7 J6.8 J6.9 LED1.2 LED2.2 MCU.2 power.3 Q2.2 Q4.2 Q7.1 Q7.2 Q7.3 Q10.1 Q10.2 Q10.3 Q14.2 Q16.2 Q29.2 Q30.2 R1.1 R13.2 R16.2 R24.2 R27.1 R36.1 R37.2 R41.1 R42.1 R46.1 R51.1 R70.1 R83.2 R90.1 R94.2 RS485.4 SW1.1 SW3.1 SW4.1 U2.3 U3.2 U4.2 U5.6 U5.7 U5.8 U5.13 U5.16 U5.17 U5.18 U5.21 U6.2 U9.2 U10.8 U10.9 U12.5 U13.2 U15.1 U15.2 U15.11 U15.14 U15.36 U15.37 U15.38 U15.39 U15.40 U15.41 U15.42 U15.43 U15.44 U15.45 U15.46 U15.47 U15.48 U15.49 U15.50 U15.51 U15.52 U15.53 U16.2 U17.1 U17.2 U17.7 U18.2 U19.5 U19.11 U19.30 U19.49 U20.2 U21.2 U22.2 U26.2 U28.8 U28.9 USB1.13 USB1.14 USB1.15 USB1.16 USB1.A1B12 USB1.B1A12 USB4.13 USB4.14 USB4.15 USB4.16 USB4.A1B12 USB4.B1A12 蜂鸣器.3
BAT+: C10.2 C20.1 C27.1 C30.1 C54.1 C55.1 C57.1 CN1.1 D7.2 J5.1 J5.2 J5.3 J5.4 J5.5 J5.6 J5.7 J5.8 J5.9 Q17.3 Q18.3 Q19.3 Q20.3 R11.1 R14.1 R18.2 R65.2 R84.2 U4.1 U10.3
SCL: eda image copy occupy.1 MCU.4 R20.1 U2.5 U17.5

Pads without a net: U2 11 12; U5 19 20; U10 2; U13 4; U15 4 7 9 10 15 17 24 25 28 29 32 33 34 35; U19 2 3 4 6 7 8 9 28 31 33 34 35 36 42 43 44 45; U28 3 13 14 15; USB1 A8 B8; USB4 A8 B8

## Via types
v1: diameter 0.61, hole 0.305, Top Layer to Bottom Layer, 346 vias

## Routing (per net, layer and track width the routed paths; a pad name or vN(x,y) marks a point on that pad's centre or on a via; arc(x,y) is an arc through that point)
3.3V: length 21.1
  Top Layer w0.254: R48.2 v1(75.95,16.31) ; R33.2 72.39,14.16 v1(72.39,15.04) 72.39,15.92 R34.2 ; R39.2 79.5,16.05 v1(79.63,16.18) ; U28.5 27.67,61.15 v1(27.56,61.27) ; U3.5 43.31,87.17 v1(43.56,87.43) ; R40.2 v1(74.17,16.31) ; R38.2 77.85,15.79 v1(77.85,16.31) ; R32.2 85.77,4.67 v1(85.85,4.67) 85.85,5.25 R29.2 ; R49.2 34.16,92.01 v1(34.16,92.51) ; R20.2 51.82,92.64 v1(51.82,93.14) ; R79.2 v1(81.91,15.66) ; R19.2 v1(53.59,97.83) ; R53.2 v1(85.85,7.67) ; U17.6 v1(56.64,75.3)
  Bottom Layer w0.254: v1(54.61,74.98) 54.64,75.02 R55.2 ; v1(43.18,91.87) 42.81,91.5 R44.2 ; v1(89.03,44.88) 88.77,45.14 R28.1 v1(87.5,45.14) 87.44,45.2 C33.2 ; C34.2 v1(81.34,3.48) C35.2 ; C25.2 58.8,85.59 v1(58.8,84.76) 58.8,84.06 C24.2
5V_RS485: length 3.6
  Top Layer w0.254: v1(79.76,79.17) 79.88,79.3 U12.8 Q5.3
+5V: length 11.5
  Top Layer w0.254: v1(43.05,73.46) 44.07,72.44 L1.2 ; U3.3 v1(36.58,88.44) ; 78.93,85.23 78.61,85.55 v1(78.61,85.78) 79.13,86.29 R80.1 ; C26.1 47.38,75.74 v1(47.37,75.74) 47.37,76.7 C29.1 47.37,76.82 v1(47.37,77.52) 47.37,78.54 C28.1 47.37,78.78 47.37,79.3 v1(47.62,79.55) 47.62,80.05 R26.2 ; U13.1 v1(58.42,81.96) ; U13.3 v1(61.09,81.96)
GND: length 56.3
  Top Layer w0.254: U2.3 19.6,76.72 19.48,76.71 19.18,77.01 19.18,78.16 v1(19.56,78.54) ; U17.2 U17.1 ; U19.49 75.22,33.79 U19.30 ; U19.49 74.22,32.79 U19.5 ; U19.49 77.22,31.29 U19.11 ; U5.16 U5.17 ; U5.17 90.06,41.73 ; U5.17 89.66,41.75 v1(89.66,42.85) 89.28,43.23 U5.13 ; USB4.A1B12 93.93,32.19 USB4.13 ; v1(56.39,77.01) 56.8,77.01 57.08,76.73 57.08,76.03 57.25,75.87 57.94,75.87 U17.7 ; CN1.7 9.16,85.66 R1.1 ; 61.61,34.09 61.61,31.96 Q16.2 ; USB4.B1A12 93.93,39.79 USB4.14 ; U10.8 34.97,80.17 v1(34.97,79.26) ; Q14.2 61.53,14.58 61.58,14.53 ; U5.8 U5.7 U5.6 ; U15.49 U15.49 U15.49 ; v1(29.72,81.97) R46.1
  Bottom Layer w0.254: C17.2 23.69,76.96 R16.2 ; C17.2 24.38,76.25 26.03,77.9 26.03,80.31 27.69,81.97 v1(29.72,81.97) ; C17.2 23.69,72.69 C15.1
  vias: v1(5.44,86.72) v1(5.44,81.64) v1(5.44,76.56) v1(5.44,71.48) v1(5.44,66.4) v1(5.44,41) v1(5.44,35.92) v1(5.44,25.76) v1(5.44,20.68) v1(5.44,10.52) v1(6.33,86.68) v1(6.33,81.6) v1(7.98,58.25) v1(9.14,60) v1(10.52,46.08) v1(10.52,25.76) v1(10.52,20.68) v1(12.57,15.54) v1(15.6,96.88) v1(15.6,46.08) v1(15.6,41) v1(15.6,35.92) v1(15.6,30.84) v1(15.6,25.76) v1(15.6,20.68) v1(15.6,15.6) v1(15.6,10.52) v1(15.6,5.44) v1(16.49,96.84) v1(20.68,91.8) v1(20.68,86.72) v1(20.68,66.4) v1(20.68,56.24) v1(22.76,95.16) v1(25.76,96.88) v1(25.76,88.28) v1(25.76,86.72) v1(30.84,98.44) v1(30.84,56.24) v1(31.12,89.97) v1(32.67,66.19) v1(33.63,76.76) v1(35.33,53.62) v1(36.83,89.71) v1(36.83,81.71) v1(37.32,79.86) v1(37.32,69.7) v1(37.32,64.62) v1(37.67,80.8) v1(37.75,66.19) v1(38.56,59.35) v1(41,51.16) v1(41,41) v1(41,35.92) v1(41,30.84) v1(41,25.76) v1(41,20.68) v1(41,15.6) v1(41,10.52) v1(41,5.44) v1(42.4,74.78) v1(42.4,69.7) v1(42.83,76.35) v1(46.08,41) v1(46.08,25.76) v1(46.08,20.68) v1(46.08,15.6) v1(47.48,69.7) v1(51.16,86.72) v1(51.16,81.64) v1(51.16,71.48) v1(51.16,61.32) v1(51.16,41) v1(51.16,25.76) v1(51.16,20.68) v1(51.16,15.6) v1(51.16,10.52) v1(51.16,5.44) v1(52.56,64.62) v1(52.56,59.54) v1(55.74,46.74) v1(55.74,41.66) v1(56.24,86.72) v1(56.24,66.4) v1(56.24,61.32) v1(56.24,56.24) v1(56.24,51.16) v1(56.24,46.08) v1(56.24,41) v1(56.24,35.92) v1(56.24,30.84) v1(56.24,25.76) v1(56.24,20.68) v1(56.24,15.6) v1(61.32,86.72) v1(61.32,66.4) v1(61.32,30.84) v1(61.32,15.6) v1(61.32,10.52) v1(66.4,96.88) v1(66.4,91.8) v1(66.4,86.72) v1(66.4,81.64) v1(66.4,71.48) v1(66.4,41) v1(66.4,15.6) v1(71.37,2.59) v1(71.48,96.88) v1(71.48,91.8) v1(71.48,86.72) v1(71.48,81.64) v1(71.48,71.48) v1(71.48,56.24) v1(71.48,51.16) v1(71.48,46.08) v1(71.63,8.81) v1(72.16,60.48) v1(72.16,55.4) v1(72.16,50.32) v1(72.16,45.24) v1(73.46,7.74) v1(73.46,3.79) v1(75.44,7.74) v1(75.44,3.79) v1(76.56,86.72) v1(76.56,81.64) v1(76.56,46.08) v1(76.56,20.68) v1(77.22,3.73) v1(77.41,7.74) v1(78.36,38.91) v1(79.25,4.12) v1(79.5,8.94) v1(79.56,2.39) v1(79.75,22.76) v1(81.64,86.72) v1(81.64,76.56) v1(81.64,71.48) v1(81.64,46.08) v1(84.83,22.76) v1(86.36,20.62) v1(86.72,96.88) v1(86.72,91.8) v1(86.72,86.72) v1(86.72,76.56) v1(86.72,71.48) v1(86.72,56.24) v1(86.72,25.76) v1(86.72,15.6) v1(89.66,43.74) v1(89.66,40.56) v1(89.93,37.01) v1(90.53,43.36) v1(91.8,96.88) v1(91.8,91.8) v1(91.8,86.72) v1(91.8,81.64) v1(91.8,76.56) v1(91.8,61.32) v1(91.8,46.08) v1(91.8,30.84) v1(91.8,25.76) v1(91.8,15.6) v1(91.8,5.44) v1(94.49,33.71) v1(94.88,39.31) v1(95.25,33.71) v1(96.01,33.71) v1(96.88,91.8) v1(96.88,71.48) v1(96.88,56.24) v1(96.88,46.08) v1(96.88,35.92) v1(96.88,25.76)
AFE_CHG: length 23.3
  Top Layer w0.254: U28.4 28.32,61.39 27.56,62.15 24.26,62.15 23.62,62.79 23.62,75.23 21.64,77.22 U2.2
AFE_DSG: length 37.2
  Top Layer w0.254: U28.6 27.03,58.62 28.12,57.53 31.06,57.53 33.02,59.49 33.02,62.28 32.38,62.92 24.77,62.92 24,63.68 24,75.36 21.64,77.72 20.39,77.72 U2.1
ALERT: length 42.1
  Top Layer w0.254: U11.1 26.1,80.4 U2.30 24.95,77.72 v1(24.77,77.9)
  Bottom Layer w0.254: U11.1 23.75,83.52 23.75,90.22 32.55,99.02 44.67,99.02 45.85,97.84 ; R16.1 24.64,78.03 v1(24.77,77.9)
BAT1: length 220.7
  Top Layer w0.254: R17.1 26.55,89.21 28.19,90.86 28.19,94.79 26.8,96.19 21.21,96.19 18.27,99.13 10.43,99.13 8.57,97.27 8.57,94.73 0.76,86.92 0.76,81.33 CN1.4 7.05,78.16 9.16,76.04 ; R6.1 17.83,54.96 v1(17.72,54.85) ; 66.87,77.34 66.87,76.95 67.58,76.24 72,76.24 72.9,77.14 72.9,80.2 R97.1 ; 66.87,77.34 R88.2 64.38,73.45 v1(64.13,73.2) ; 66.87,77.34 Q28.2 ; R7.1 13.47,75.75 11.68,73.97 C5.1 10.73,74.11 9.33,75.51 C6.2
  Bottom Layer w0.254: v1(64.13,73.2) 63.5,73.84 59.18,73.84 36.19,50.85 1.52,50.85 1.02,51.36 1.02,77.78 1.4,78.16 CN1.4 5.84,78.16 6.41,77.58 6.41,60.82 9.65,57.58 14.99,57.58 v1(17.72,54.85)
BAT+: length 28.4
  Top Layer w0.254: v1(40.77,82.52) 40.74,82.54 U10.3 ; Q18.3 11.63,31.22 v1(11.56,31.29) ; v1(9.91,18.34) 11.51,18.34 Q19.3 ; v1(31.88,61.77) 31.75,61.9 R84.2 ; R14.1 13.34,63.93 v1(13.21,63.93) ; R18.2 v1(21.84,94.28)
  Top Layer w1: R11.1 9.33,63.73 v1(9.33,64.7) C10.2 ; R65.2 10.19,41.36 8.51,43.04
  Top Layer w1.2: U4.1 5.69,28.39 C54.1 6.59,34.09 6.59,38.53 ; 12.19,3.8 v1(12.19,4.91) 12.19,5.9 Q20.3
  Bottom Layer w0.254: C27.1 39.86,82.52 v1(40.77,82.52) 41.55,82.52 C20.1 ; v1(41.78,83.11) 41.84,83.17 C30.1
  vias: v1(9.65,41.45)
BOOT_LIMIT: length 5.8
  Top Layer w0.254: D28.2 70.87,74.35 69.47,72.95 69.47,70.7 D27.1
BOOT_MANUAL: length 4.9
  Top Layer w0.254: R45.1 16.89,93.02 18.05,94.17 SW2.2
BQV1: length 69.1
  Top Layer w0.254: v1(29.34,83.49) 30.23,83.49 R47.2 30.35,83.88 30.35,86.79 v1(31.12,87.55) ; v1(36.32,92.76) 35.81,92.25 35.81,86.79 36.83,85.78 42.42,85.78 45.97,82.22 48.01,82.22 50.42,79.81 50.42,74.6 54.87,70.15 R89.1 ; U2.8 21.36,74.22 21.48,74.35 v1(22.35,74.35)
  Bottom Layer w0.254: 22.29,74.35 v1(22.35,74.35) 20.7,76 20.7,78.16 21.59,79.05 24.13,79.05 28.57,83.49 v1(29.34,83.49) ; v1(36.32,92.76) v1(31.12,87.55)
BST1: length 4.3
  Top Layer w0.254: U19.17 78.55,32.71 79.86,32.71 80.33,32.24 80.65,32.24 80.71,32.18 v1(81.28,32.18)
  Bottom Layer w0.254: U6.1 81.03,31.93 v1(81.28,32.18)
BST2: length 19.6
  Top Layer w0.254: U19.22 79.38,35.29 v1(79.69,35.61) ; U18.1 85.6,43.23 85.79,43.04 C48.2 85.47,43.42 v1(85.47,43.48)
  Bottom Layer w0.254: v1(79.69,35.61) 80.52,35.61 83.8,38.89 86.59,38.89 88.14,40.44 88.14,41.58 86.23,43.48 v1(85.47,43.48)
CAN_RX: length 10
  Top Layer w0.254: MCU.10 40.77,89.46 38.48,87.17 U3.4
CAN_STB: length 12.5
  Top Layer w0.254: 38.23,97.84 39.41,99.02 41.75,99.02 42.03,98.73 42.03,91.68 U3.8
CAN_TX: length 10.1
  Top Layer w0.254: 40.77,97.84 40.77,96.97 39.59,95.79 39.59,93.04 39.38,92.83 39.12,92.83 38.58,93.37 38.2,93.37 37.5,92.67 37.5,92.29 38.05,91.75 38.05,91.5 U3.1
CANH: length 21.4
  Top Layer w0.254: 42.73,89.71 45.47,89.71 R52.2 48.97,90.47 D5.1 56.32,90.54 CAN.3
CANL: length 21.1
  Top Layer w0.254: U3.6 45.71,88.44 R52.1 48.71,88.96 D5.2 56.96,88.64 CAN.2
CC1: length 38.9
  Top Layer w0.254: v1(71.75,41.07) 71.88,40.94 86.11,40.94 87.38,42.22 87.38,43.36 87.65,43.63 U5.12 ; U19.41 71.03,34.29 70.2,33.45 v1(68.2,33.45) ; Q15.3 68.22,27.52 68.22,29.28 68.83,29.89 v1(68.83,30.78)
  Bottom Layer w0.254: v1(71.75,41.07) 68.33,37.64 68.33,33.58 v1(68.2,33.45) 68.83,32.82 v1(68.83,30.78)
CC2: length 42.5
  Top Layer w0.254: Q13.3 66.29,36.37 67.9,37.98 67.94,37.98 70.1,35.82 70.1,35.79 U19.38 ; 88.54,44.03 88.52,44.01 87.52,44.01 87.02,43.51 87.02,42.51 85.84,41.33 72.9,41.33 v1(71.88,42.34)
  Bottom Layer w0.254: v1(71.88,42.34) 65.79,42.34 65.41,41.96 65.41,37.14 v1(66.17,36.37)
CELL1: length 12.3
  Top Layer w0.254: C2.1 10.86,83.24 C1.2 11.44,83.87 R2.1 ; C2.1 9.48,81.82 ; C2.1 8.14,83.16 CN1.6
CELL2: length 24.6
  Top Layer w0.254: R3.1 11.34,78.38 C4.2 ; C4.2 C3.2 C3.1 ; C4.2 10.86,76 C6.1 ; CN1.5 8.61,80.66 C3.1 ; R4.1 R5.1 12.73,81.84 C2.2 10.86,81.21 C3.1 ; C3.1 C4.1
CELL4: length 12.8
  Top Layer w0.254: 9.33,73.05 C5.2 7.64,75.66 CN1.3 ; 9.33,73.05 12.68,73.05 R8.1 ; 9.33,73.05 C7.1
CELL5: length 23.5
  Top Layer w0.254: R9.1 13.07,70.03 10.73,70.03 ; 10.73,70.03 C9.2 C10.1 ; 10.73,70.03 C7.2 ; C8.1 9.33,70.03 ; 9.33,70.03 C8.2 ; 9.33,70.03 C9.1 ; 13.61,65.71 13.61,70.31 13.72,70.42 ; CN1.2 6.2,73.16 8.91,70.45
CSN1: length 97.1
  Top Layer w0.254: C42.1 72.45,19.48 71.43,20.5 ; v1(59.82,70.28) 59.82,75.11 60.96,76.25 60.96,76.5 60.52,76.94 59.03,76.94 58.88,76.8 U17.9 ; 76.72,28.96 U19.10 ; 76.72,28.96 73.34,25.58 73.13,25.58 74.18,24.53 74.18,19.23 ; 76.72,28.96 76.77,29.01 77.47,29.01 77.72,29.25 U19.12 U19.13 ; R60.1 79.68,21.96 76.7,21.96 Q12.5
  Bottom Layer w0.254: v1(72.01,19.99) 61.72,19.99 59.82,21.9 v1(59.82,70.28)
CSN2: length 36.4
  Top Layer w0.254: R57.1 89.15,52.94 C45.1 89.03,52.76 v1(89.41,52.38) ; U19.25 77.72,38.16 v1(77.22,38.66)
  Bottom Layer w0.254: v1(77.22,38.66) 78.61,40.06 87.12,40.06 87.7,40.63 87.7,40.64 87.71,40.65 87.71,41.14 87.7,41.14 87.7,41.33 86.3,42.72 84.2,42.72 83.69,43.23 83.69,46.66 v1(89.41,52.38)
CSP1: length 11
  Top Layer w0.254: 78.03,25.51 77.41,25.51 76.96,25.96 76.96,27.74 77.47,28.25 78.23,28.25 79.38,29.39 79.38,30.91 79,31.29 U19.14 ; 78.03,25.51 77.98,25.46 C50.2 ; 78.03,25.51 R61.1
CSP2: length 100.2
  Top Layer w0.254: 86.74,66.6 86.14,66 F2.2 ; 66,39.48 59.57,33.05 U22.1 ; 66,39.48 v1(66.36,39.48) ; 66,39.48 62.93,39.48 61.34,41.07 61.34,63.3 62.36,64.31 79.46,64.31 F2.2 ; F2.2 82.04,65.09 82.04,56.69 83.71,55.02 R56.2 85.3,55.02 C45.2 ; v1(68.58,38.92) 68.58,38.41 69.27,37.72 73.16,37.72 73.93,38.48 76.46,38.48 76.72,38.23 U19.27 U19.26
  Bottom Layer w0.254: v1(68.58,38.92) 66.92,38.92 v1(66.36,39.48)
DBG_USB_VBUS: length 1.4
  Top Layer w0.254: USB1.B4A9 v1(59.88,7.16) ; USB1.A4B9 v1(55.08,5.77)
DC_IN: length 3.2
  Top Layer w0.254: U25.2 75.31,78.79 v1(75.56,79.05) ; R91.1 74.17,86.93 v1(74.17,87.55) 74.17,88.43 R86.1 ; 78.3,91.57 78.3,91.43
DMC: length 28.3
  Top Layer w0.254: U19.40 71.39,34.71 70.95,34.71 70.33,34.09 v1(68.96,34.09) ; U5.15 88.52,42.41 88.52,41.33 87.5,40.31 v1(72.9,40.31)
  Bottom Layer w0.254: v1(72.9,40.31) 72.14,40.31 68.96,37.14 v1(68.96,34.09)
DPC: length 26
  Top Layer w0.254: U19.39 70.8,35.29 70.23,34.72 v1(69.72,34.72) ; v1(87.12,40.89) 87.73,41.5 87.73,42.51 88.07,42.85 88.52,42.85 88.54,42.83
  Bottom Layer w0.254: v1(69.72,34.72) 69.72,36.75 71.25,38.28 72.39,38.28 75.01,40.89 v1(87.12,40.89)
DSG_G: length 95.9
  Top Layer w0.254: 52.07,33.21 52.72,33.21 54.61,35.1 54.61,37.9 56.9,40.18 56.9,48.69 ; 52.07,33.21 52.07,35.1 51.44,35.74 48.51,35.74 ; 52.07,33.21 52.07,19.86 50.55,18.34 ; 48.51,35.74 47.5,34.72 R68.1 ; 48.51,35.74 48.51,39.12 D8.1 47.5,40.75 R69.1 ; 47.5,20.5 48.38,20.5 50.55,18.34 ; D19.1 41.98,59.25 Q25.2 47.74,50.76 R71.2 55.12,50.47 56.9,48.69 ; 50.55,18.34 50.55,7.55 49.5,6.5 ; R73.1 58.54,50.33 56.9,48.69
ESP_EVENT_N: length 26.9
  Top Layer w0.254: U15.6 83.19,5.77 83.32,5.89 R29.1 v1(82.71,6.89)
  Bottom Layer w0.254: v1(82.71,6.89) 87.23,6.89 94.36,14.02 94.36,20.88 93.22,22.02
ESP_RST_N: length 34.8
  Top Layer w0.254: 84.67,10.35 84.67,10.34 ; 84.67,10.34 83.85,9.51 83.69,9.51 ; 84.67,10.34 89.79,10.34 ; 83.64,7.29 83.82,7.47 83.82,9.39 ; 90.15,10.21 91.82,10.21 99.36,17.75 99.36,19.43 98.68,20.12 92.58,20.12 90.68,22.02 ; U15.8 81.52,7.54 83.64,7.54
ESP_RX: length 44.9
  Top Layer w0.254: U15.30 69.41,5.64 v1(67.31,5.64)
  Bottom Layer w0.254: v1(67.31,5.64) 67.69,5.26 87.63,5.26 99.44,17.07 99.44,20.88 98.3,22.02
ESP_TX: length 45.4
  Top Layer w0.254: U15.31 66.97,4.97 v1(66.29,5.64)
  Bottom Layer w0.254: 95.76,22.02 97.03,20.75 97.03,15.54 87.71,6.22 66.75,6.22 66.29,5.77 v1(66.29,5.64)
GPIO21: length 10.8
  Top Layer w0.254: R42.2 63.56,33.83 Q16.1 64.56,30.91 67.31,30.91 68.19,31.79 U19.46
GPIO22: length 26
  Top Layer w0.254: 59.76,16.45 59.76,15 59.71,14.95 59.71,14.53 ; U19.47 70.74,31.29 68.58,29.13 68.58,18.85 68.07,18.34 66.04,18.34 65.15,17.45 60.63,17.45 59.63,16.45
HG1: length 6.1
  Top Layer w0.254: Q11.4 82.31,29.62 79.65,32.29 U19.16
HG2: length 57.8
  Top Layer w0.254: 95.4,54.2 95.58,54.2 99.57,50.22 99.57,30.15 v1(97.79,28.37) ; v1(79.63,36.5) 78.92,35.79 U19.23
  Bottom Layer w0.254: v1(97.79,28.37) 97.28,27.86 79.76,27.86 78.36,29.26 78.36,35.23 v1(79.63,36.5)
HS_CHG_DRV: length 10.6
  Top Layer w0.254: U28.16 30.28,51.53 29.72,50.98 24.77,50.98 23.63,52.11 R64.2
HS_DSG_DRV: length 5.9
  Top Layer w0.254: U28.12 27.67,55.17 27.93,55.43 30.35,55.43 31.21,54.57 31.72,54.57 R76.2
IO2: length 2.6
  Top Layer w0.254: U15.5 83.23,4.97 83.7,4.5
IO4: length 26.4
  Top Layer w0.254: U15.18 75.44,11.03 77.16,12.75 77.85,12.75 79.26,14.16 R39.1 78.74,14.92 78.74,16.43 79.12,16.81 93.6,16.81 H2.4
IO5: length 25.4
  Top Layer w0.254: H2.3 91.44,17.2 77.85,17.2 76.78,16.13 76.78,14.53 77.16,14.16 R38.1 77.21,13.64 76.66,13.64 74.64,11.62 U15.19
IO6: length 23.9
  Top Layer w0.254: 75.83,14.28 75.06,15.05 75.06,16.69 76.28,17.91 89.04,17.91 90.11,18.97 H2.2 ; 75.83,14.28 R48.1 ; 75.83,14.28 75.82,14.28 73.84,12.29 U15.20
IO7: length 22.7
  Top Layer w0.254: H2.1 87.76,18.59 75.18,18.59 73.28,16.69 73.28,15.05 R40.1 73.04,13.03 U15.21
IO10: length 27.8
  Top Layer w0.254: H2.5 95.78,16.46 80.67,16.46 80.39,16.18 80.39,14.78 81.03,14.15 81.27,14.15 ; 81.27,14.15 R79.1 ; 81.27,14.15 79.49,12.37 77.85,12.37 77.04,11.56 U15.16
J_RS485_A: length 17.9
  Top Layer w0.254: U12.6 82.42,79.17 85.98,75.62 96.9,75.62 97.54,76.25
J_RS485_B: length 20
  Top Layer w0.254: 81.15,80.2 81.15,81.08 81.66,81.58 84.58,81.58 85.22,80.95 85.22,79.55 86.61,78.16 96.9,78.16 97.54,78.79
J_RS485_DI: length 16.3
  Top Layer w0.254: RS485_MCU.1 92.47,74.84 U12.4
J_RS485_RO: length 23.2
  Top Layer w0.254: U12.1 79.88,73.71 80.9,72.69 90.17,72.69 97.79,65.08 RS485_MCU.3
KEY_IN: length 9.5
  Top Layer w0.254: 32.27,91.87 32,92.15 32,97.44 32.28,97.71 35.56,97.71 35.69,97.84
LED_GREEN: length 3.8
  Top Layer w0.254: R31.2 83.32,11.48 81.03,11.48 80.24,10.69 U15.12
LED_RED: length 6
  Top Layer w0.254: 83.04,14.15 83.04,13.24 82.04,12.24 80.01,12.24 79.44,11.67 79.44,10.79
LG1: length 17.5
  Top Layer w0.254: v1(90.81,38.15) 89.41,39.55 Q10.4 ; U19.19 78.55,33.71 79.93,33.71 v1(80.01,33.79)
  Bottom Layer w0.254: v1(80.01,33.79) 80.81,34.59 89.41,34.59 90.68,35.86 90.68,38.02 v1(90.81,38.15)
LG2: length 56.2
  Top Layer w0.254: Q7.4 v1(90.93,50.61) ; U19.20 79.25,34.29 v1(79.25,34.29)
  Bottom Layer w0.254: v1(79.25,34.29) 78.74,33.78 78.74,29.77 79.25,29.26 98.3,29.26 99.46,30.42 99.46,49.44 97.92,50.98 91.44,50.98 91.08,50.61 v1(90.93,50.61)
LX1: length 40.6
  Top Layer w0.254: C49.1 82.9,33.52 82.98,33.43 ; C49.1 80.97,33.21 78.55,33.21 U19.18 ; C49.1 R59.2 81.65,35.74 Q10.8 ; 83.63,39.55 69.34,39.55 66.55,42.34 66.55,52.77 L2.1
LX2: length 56.6
  Top Layer w0.254: R58.2 75.82,48.06 78.73,50.97 78.73,54.41 ; L2.2 84.81,48.71 Q7.9 ; U19.21 78.92,34.79 79.01,34.88 79.49,34.88 79.58,34.79 v1(80.14,34.79) ; Q8.1 91.59,52.9 90.17,51.49 87.88,51.49 86.36,49.96 Q7.9 ; Q7.9 85.85,48.2 C48.1 84.9,45.39 v1(84.58,45.39)
  Bottom Layer w0.254: v1(84.58,45.39) 84.84,45.39 88.52,41.71 88.52,40.31 86.74,38.53 83.95,38.53 80.21,34.79 v1(80.14,34.79)
MCU_ADC_NTC: length 4.5
  Bottom Layer w0.254: U16.1 R44.1 43.31,93.64 MCU.8
MCU_WAKE_BQ: length 39.9
  Top Layer w0.254: v1(18.54,84.25) 18.54,83.47
  Bottom Layer w0.254: v1(18.54,84.25) 22.48,80.32 24.13,80.32 29.97,86.16 43.56,86.16 45.34,87.94 45.34,94.79 45.85,95.3
MID+: length 19.4
  Top Layer w0.254: R21.1 47.65,46.41 35.03,46.41 Q21.2 ; D6.1 51.58,46.91 48.09,46.91 48,47
MP9486_EN: length 5.9
  Top Layer w0.254: R47.1 R46.2 34.44,81.97 U10.7 U10.6
P+: length 38.4
  Top Layer w0.254: v1(29.08,52.5) 28.69,52.5 R85.2 ; C58.2 v1(18.67,1.83) ; R25.2 50.29,30.66 v1(49.91,30.28)
  Top Layer w1: v1(44.58,48.95) 44.71,48.95 R71.1 ; v1(44.58,48.95) 44.58,47.74 Q21.3 ; v1(44.58,48.95) 43.55,49.97 R72.1 ; Q26.2 52.15,53.01 50.44,53.01 D14.2 v1(49.01,53.03) R74.1 ; D8.2 v1(46.71,36.08) 46.18,35.54 Q22.3 ; U21.1 76.33,66.6 ; U25.1 75.31,67.98 76.34,66.95 ; U27.1 v1(46.81,12.62) 45.73,11.54 Q24.3 ; Q23.3 44.38,23.55 v1(46.54,23.55) C59.1
P-: length 9.1
  Top Layer w0.254: C60.2 v1(47.62,25.96) ; R82.2 v1(33.91,78.54) 34.29,78.54 34.54,78.28 34.54,76.02 R70.2 ; v1(47.5,8.94) 48.31,8.94 U27.2 ; R75.1 v1(53.85,61.27)
PACKDIV_adc: length 62.5
  Top Layer w0.254: MCU.7 43.31,96.97 44.49,95.79 44.49,92.72 44.7,92.51 v1(45.97,92.51) ; v1(21.78,59.87) C12.2 21.78,54.73 21.52,54.47
  Bottom Layer w0.254: v1(45.97,92.51) 45.97,71.93 34.67,60.63 22.54,60.63 v1(21.78,59.87)
PCIN: length 86.7
  Top Layer w0.254: R56.1 v1(87.15,61.16)
  Bottom Layer w1: v1(87.15,61.16) 88.14,60.16 88.14,52.76 82.42,47.04 66.93,47.04 64.76,44.87 64.76,42.35 64.68,42.26 64.68,24.28 67.94,21.01 73.91,21.01 77.22,24.31 77.22,35.74 v1(78.61,37.14)
  vias: v1(83.19,62.79) v1(85.22,62.79) v1(87.38,62.66) v1(88.26,61.39) v1(89.98,60.88) v1(90.55,59.23) v1(96.52,58.72) v1(96.52,57.45)
PCON: length 110.6
  Top Layer w0.254: R60.2 81.53,26.61 81.05,27.09 R61.2 79.76,28.74 79.76,31.29 79.26,31.79 U19.15
  Bottom Layer w1: v1(82.68,25.2) 82.68,20.37 80.14,17.83 61.59,17.83 58.42,21.01 58.42,70.92 ; v1(58.42,77.52) 58.49,77.59 64.76,77.59 65.46,76.89 65.46,73.14 64.13,71.81 59.18,71.81 58.55,71.17
  vias: v1(57.69,77.58) v1(80.26,25.2) v1(83.38,26.03) v1(83.69,26.72)
PMON-EN: length 54
  Top Layer w0.254: U28.7 26.38,58.39 27.69,57.07 31.88,57.07 33.53,58.72 33.53,75.39 32.71,76.21 32.71,80.02 31.31,81.42 31.31,84.29 33.27,86.25 33.27,95.05 34.8,96.57 36.96,96.57 38.23,95.3
PRECHARGE_REQ: length 74.4
  Top Layer w0.254: 35.69,95.3 35.18,94.79 35.18,86.41 36.32,85.27 42.04,85.27 45.59,81.71 47.5,81.71 49.4,79.81 49.4,74.6 59.94,64.06 59.94,50.47 57.78,48.31 R23.1
RS485_DIR: length 20.3
  Top Layer w0.254: 81.15,74.84 U12.3 82.42,74.22 83.06,73.58 91.19,73.58 RS485_MCU.2
RS485_PWR_EN: length 29.3
  Top Layer w0.254: R93.1 92.33,80.95 93.85,79.43 98.68,79.43 99.12,78.98 99.12,63.23 RS485_MCU.4
SCL: length 91.6
  Top Layer w0.254: U17.5 53.12,75.11 v1(51.56,75.11) ; v1(19.43,80.7) 19.43,79.93 18.29,78.79 18.29,76.25 18.82,75.72 U2.5 ; v1(20.83,99.24) 20.97,99.38 46.47,99.38 47.03,98.82 47.03,97.04 48.39,95.68 MCU.4 48.39,94.67 51.31,91.75 54.92,91.75
  Bottom Layer w0.254: v1(51.56,75.11) 51.05,75.11 48.64,77.52 48.64,95.05 MCU.4 ; v1(20.83,99.24) 20.83,98.35 16.26,93.78 16.26,83.87 v1(19.43,80.7)
SDA: length 92.7
  Top Layer w0.254: U17.4 52.52,75.8 51.89,76.44 v1(51.82,76.44) ; U2.4 19.21,76.22 18.8,76.63 18.8,78.66 20.07,79.93 v1(20.07,80.06) ; MCU.3 49.66,96.57 49.66,94.79 50.42,94.03 51.44,94.03 53.72,96.32 56.41,96.32 U1.1
  Bottom Layer w0.254: v1(20.07,80.06) 20.07,81.2 17.14,84.12 17.14,93.9 22.81,99.57 46.65,99.57 MCU.3 49.57,96.66 49.57,78.63 51.76,76.44 v1(51.82,76.44)
SRN: length 6.4
  Top Layer w0.254: U2.29 26.91,77.22 28.1,78.41 32,78.41
SRP: length 5.3
  Top Layer w0.254: 31.42,76.72 U2.28
TS1: length 153.3
  Top Layer w0.254: CN7.2 6.29,64.42 8,62.71 ; 18.29,80.33 17.74,79.78 v1(17.61,79.78) 17.78,79.62 17.78,76 18.56,75.22 U2.6 ; 9.02,61.48 8.94,61.56 8.94,61.49 9.02,61.41 9.02,61.48 ; 9.02,61.48 9.02,61.69 8,62.71 ; 8,62.71 2.41,57.12 2.41,53.14 3.81,51.74 v1(7.75,51.74) ; 8,62.71 v1(8,69.79) ; D28.1 69.69,76.63 68.07,76.63 67.56,77.14 67.56,78.28 67.44,78.41 56.9,78.41 55.69,77.2 55.69,72.76 v1(54.86,71.93) ; SW2.1 10.65,93.16 U14.1
  Bottom Layer w0.254: U14.1 11.75,93.02 15.83,88.94 15.83,81.89 17.61,80.1 v1(17.61,79.78) 17.61,78.5 8.91,69.79 v1(8,69.79) ; v1(7.75,51.74) 34.67,51.74 v1(54.86,71.93)
TS2: length 33.4
  Top Layer w0.254: U2.13 21.19,71.72 23.23,69.68 23.23,63.79 20.83,61.39 13.1,61.39 11.88,60.17 11.88,58.36 C38.2 8.34,55.91 CN8.2
USB_ALERT: length 24.1
  Top Layer w0.254: INA226.1 64.64,83.24 60.83,79.43 57.26,79.43 v1(54.64,76.81) 54.14,76.3 U17.3
USB_CC1: length 14.3
  Top Layer w0.254: U5.4 94.22,43.63 95.76,42.09 95.76,35.23 95.27,34.74 USB4.A5
USB_CC2: length 11.8
  Top Layer w0.254: USB4.B5 93.4,37.67 94.05,37.67 94.07,37.64 v1(95.12,37.64) ; v1(92.07,44.37) 91.73,44.03 91.54,44.03
  Bottom Layer w0.254: v1(95.12,37.64) 95.12,38.41 95.76,39.04 95.76,42.09 93.47,44.37 v1(92.07,44.37)
USB_D+: length 16
  Top Layer w0.254: USB1.A6 57.3,6.34 57.3,5.7 57.46,5.54 57.99,5.54 58.16,5.7 58.16,6.52 58.3,6.66 58.3,7.13 59.53,8.36 63.49,8.36 arc(63.66,8.29) 63.74,8.11 63.74,7.92 arc(63.99,7.67) 64.24,7.92 64.24,8.11 arc(64.31,8.29) 64.49,8.36 68.69,8.36 68.88,8.17 U15.27
USB_D-: length 15.9
  Top Layer w0.254: USB1.A7 57.73,7.47 ; 57.73,7.47 57.53,7.67 56.98,7.67 56.73,7.42 56.73,6.2 ; 57.73,7.47 57.98,7.47 59.28,8.77 68.69,8.77 68.88,8.97 U15.26
USB_DMC: length 11.1
  Top Layer w0.254: USB4.A7 92.19,36.24 91.94,35.99 91.94,35.48 92.19,35.23 93.32,35.23 93.38,35.29 ; 91.86,36.07 91.54,36.39 91.54,38.85 91.36,39.03 90.98,39.03 90.81,39.21 90.81,40.37 90.98,40.55 91.36,40.55 91.54,40.73 U5.1
USB_DPC: length 11.1
  Top Layer w0.254: USB4.A6 94.49,35.74 94.74,36 94.74,36.56 94.56,36.74 USB4.B6 92.59,36.74 92.33,37.01 92.33,42.54 92.04,42.83 91.54,42.83
USB_ESD_FLT: length 0.8
  Top Layer w0.254: U5.9 89.66,44.75 v1(89.66,45.52)
USB_VBUS: length 7.9
  Top Layer w0.254: 69.34,27.29 69.34,29.13 70.99,30.78 71.46,30.78 U19.48 ; v1(59.21,76.3) 58.01,76.3 ; v1(94.49,38.66) 94.22,38.39 USB4.B4A9 ; USB4.A4B9 v1(92.58,33.59)
  vias: v1(69.34,28.85) v1(91.57,33.58)
VC0: length 23.2
  Top Layer w0.254: R1.2 11.04,87.04 11.56,87.55 13.72,87.55 14.35,86.92 14.35,85.52 14.99,84.89 19.05,84.89 20.07,83.87 20.07,81.78 24.77,77.08 24.77,76.74 25.29,76.22 U2.27
VC1: length 32.4
  Top Layer w0.254: 16.64,91.24 14.99,89.59 14.99,86.15 R2.2 23.5,86.03 v1(28.45,81.08) ; v1(30.86,75.74) 30.84,75.72 U2.26
  Bottom Layer w0.254: v1(30.86,75.74) 30.86,78.66 v1(28.45,81.08)
VC2: length 15.2
  Top Layer w0.254: U2.25 25.26,75.22 24.77,75.72 24.77,76.19 19.5,81.46 17.93,81.46 15.21,78.74 R3.2
VC3: length 33.1
  Top Layer w0.254: U2.24 27.04,74.72 27.43,75.11 v1(30.23,75.11) ; R4.2 15.31,83.55 v1(16.76,82.09)
  Bottom Layer w0.254: v1(30.23,75.11) 31.05,75.11 31.44,75.5 31.44,82.27 29.64,84.07 28.52,84.07 23.93,79.48 19.38,79.48 v1(16.76,82.09)
VC4: length 26.6
  Top Layer w0.254: R5.2 14.48,80.3 14.48,77.65 15.37,76.76 16.57,76.76 v1(16.8,76.54) ; v1(29.72,74.35) 29.59,74.22 U2.23
  Bottom Layer w0.254: v1(16.8,76.54) 16.8,75.9 21.27,71.42 24.38,71.42 27.31,74.35 v1(29.72,74.35)
VC5: length 37.3
  Top Layer w0.254: 18.79,56.55 18.79,56.3 15.19,56.3 U24.1 ; v1(32,71.81) 31.1,70.9 30.99,70.9 30.99,72.44 29.71,73.72 U2.22 ; v1(18.8,57.58) 18.8,56.64 R6.2
  Bottom Layer w0.254: v1(18.8,57.58) 18.8,58.09 26.8,66.09 30.35,66.09 32,67.74 v1(32,71.81)
VC5B: length 23
  Top Layer w0.254: R7.2 15.33,75.55 v1(16.32,75.55) ; U2.21 29.19,73.22 v1(30.16,72.25)
  Bottom Layer w0.254: v1(30.16,72.25) 30.16,72.26 29.21,73.21 26.81,73.21 24.51,70.92 20.7,70.92 16.32,75.3 v1(16.32,75.55)
VC5X: length 2.7
  Top Layer w0.254: 18.91,68 18.03,67.12 18.03,65.69
VC5x: length 51.2
  Top Layer w0.254: 30.62,67.5 27.69,64.57 U8.2 ; 19.06,68.15 17.78,69.42 17.78,72.06 18.94,73.22 U2.10 ; v1(17.53,60) 14.92,60 C38.1 8.19,53.26 4.34,53.26 CN8.1 ; v1(18.07,67.16) 18.37,67.16 C11.2
  Bottom Layer w0.254: v1(17.53,60) 17.53,66.61 v1(18.07,67.16) 19.16,68.25 28.7,68.25 v1(29.95,67.01)
VC6: length 20.3
  Top Layer w0.254: v1(16.64,73.84) 15.23,73.84 R8.2 ; v1(29.34,72.19) 28.81,72.72 U2.20
  Bottom Layer w0.254: v1(16.64,73.84) 20.07,70.41 24.64,70.41 26.92,72.69 28.83,72.69 v1(29.34,72.19)
VC7: length 19
  Top Layer w0.254: U2.19 28.29,72.22 v1(28.45,72.06) ; R9.2 v1(15.75,72.18)
  Bottom Layer w0.254: v1(28.45,72.06) 27.05,72.06 25.04,70.05 24.64,69.9 24.38,69.77 19.69,69.77 17.28,72.18 v1(15.75,72.18)
VC8: length 17.2
  Top Layer w0.254: v1(15.88,69.14) 15.36,68.62 R10.2 ; U2.18 27.9,71.72 v1(28.32,71.3)
  Bottom Layer w0.254: v1(28.32,71.3) 27.05,71.3 24.89,69.14 v1(15.88,69.14)
VC9: length 17
  Top Layer w0.254: R15.2 16.13,66.48 v1(16.13,66.6) ; v1(27.69,69.52) 27.69,70.79 27.26,71.22 U2.17
  Bottom Layer w0.254: v1(27.69,69.52) 26.8,68.63 18.16,68.63 v1(16.13,66.6)
VC10: length 22.9
  Top Layer w0.254: v1(19.3,62.15) 12.95,62.15 11.43,63.68 R11.2 ; v1(26.67,67.36) 25.78,68.25 D3.2 26.1,68.58 U2.16
  Bottom Layer w0.254: v1(19.3,62.15) 22.1,62.15 26.67,66.73 v1(26.67,67.36)
VOUT2G: length 11
  Top Layer w0.254: Q12.4 69.66,22.97 v1(70.61,22.02) ; U19.1 72.26,30 72.26,29.01 v1(72.99,28.28)
  Bottom Layer w0.254: v1(72.99,28.28) 70.61,25.9 v1(70.61,22.02)
WAKE_ALLOW: length 4.8
  Top Layer w0.254: Q30.3 62.63,73.48 62.63,76.93 Q29.1
WAKE_G: length 5.6
  Top Layer w0.254: R97.2 69.8,80.44 69.47,80.11 69.47,77.66 69.29,77.49 Q28.1 68.82,77.54
WAKE_LED_A: length 6.9
  Top Layer w0.254: 69.47,89.41 71.69,89.41 R86.2 R91.2 72.53,85.05 D26.1
WAKE_OFF_G: length 4.3
  Top Layer w0.254: 58.55,68.39 58.71,68.23 60.74,68.23 60.77,68.27 60.77,70.28
WAKE_OPTO_E: length 3.8
  Top Layer w0.254: U26.3 66.12,79.31 Q29.3
WAKE_RAW: length 2
  Top Layer w0.254: 67.71,73.08 67.82,73.19 Q28.3
$1N76: length 2.8
  Top Layer w0.254: U2.7 21.2,74.72 v1(22.22,75.74)
  Bottom Layer w0.254: v1(22.22,75.74) 22.22,76.19 22.16,76.25
$1N110: length 4.7
  Top Layer w0.254: C11.1 20.61,68.47 19.22,69.85 19.22,70.87 19.57,71.22 U2.14
$1N114: length 13.5
  Top Layer w0.254: U2.15 22.5,68.61 22.5,66.16 U8.1 20.03,63.69 18.03,63.69 17.76,63.42 15.61,63.42
$1N127: length 10.8
  Top Layer w0.254: Q1.1 19.75,90.72 R17.2 25.09,90.72 U9.1 24.06,92.27 C19.1
$1N129: length 2.2
  Top Layer w0.254: 19.81,92.13 19.81,94.28 R18.1
$1N133: length 34.3
  Top Layer w0.254: v1(21.97,73.08) 21.33,73.72 U2.9 18.92,73.72 17.38,75.25 17.38,78.68 v1(17.02,79.05) ; Q1.2 20.76,89.14 20.19,88.57 18.67,88.57 18.03,89.2 18.03,91.62 17.54,92.11 16,92.11 v1(13.35,89.46)
  Bottom Layer w0.254: v1(21.97,73.08) 22.16,72.89 22.16,72.57 ; v1(17.02,79.05) 13.35,82.71 v1(13.35,89.46)
